# Altium project SG2002_QFN88_38_20230301_4L_V1.3_16.2.PrjPcb (part 1 of 2)
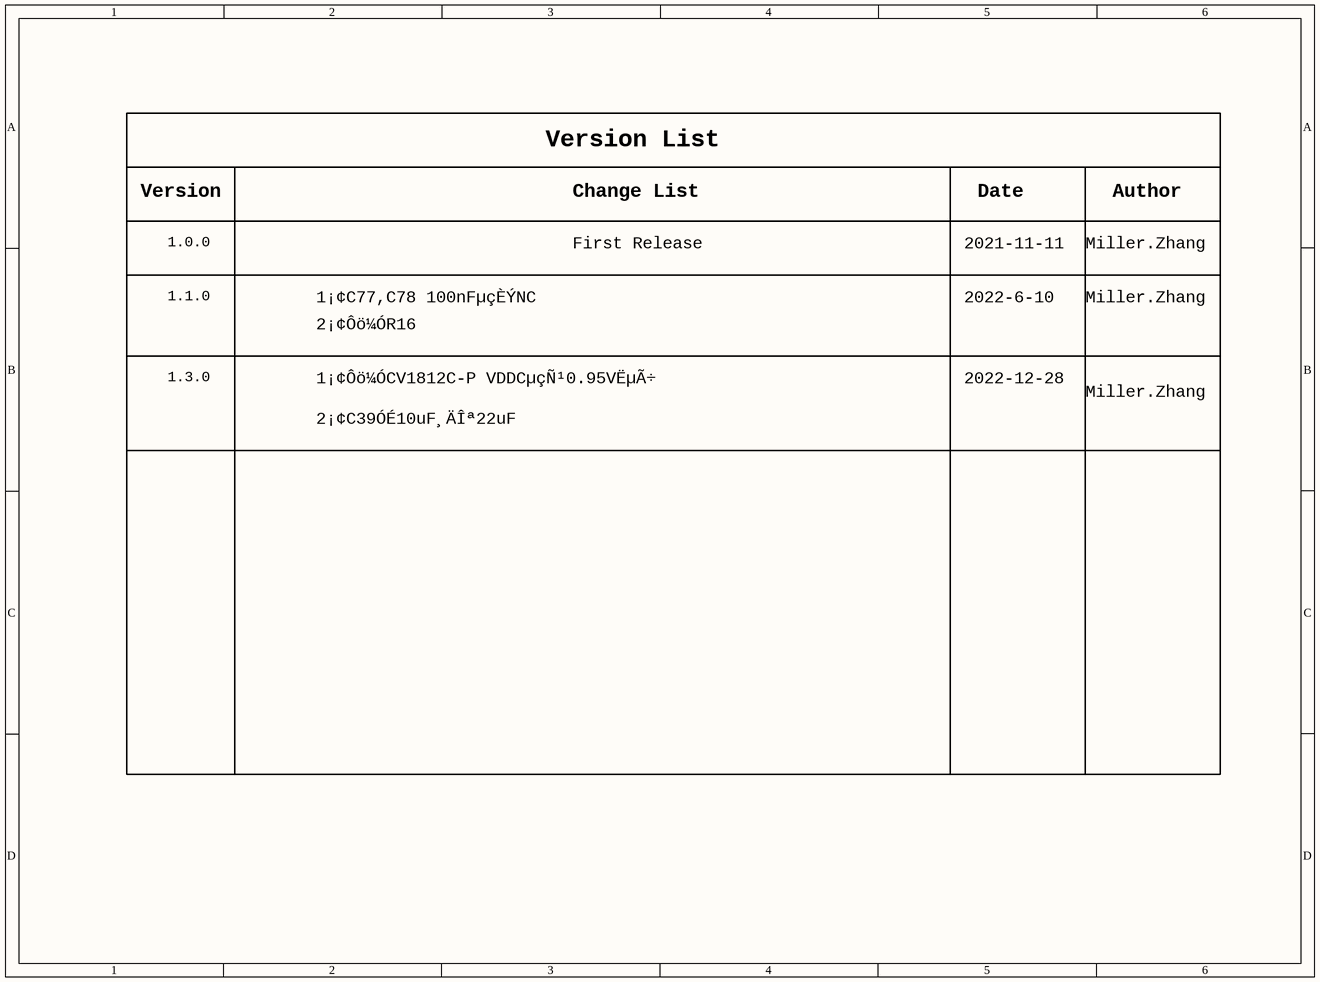
[diagram p0: 01_Cover.SchDoc]
10 sheets, 186 parts. Net scope: global (net labels, ports and power ports of the same name join across sheets).
Sheets:
  01_Cover.SchDoc
  02_Diagram.SchDoc
  03_Power tree.SchDoc
  04_Main.SchDoc
  05_SYS_Power.SchDoc
  06_eMMC_SDIO_SPINAND_SPINOR.SchDoc
  07_USB_LED.SchDoc
  08_RJ45.SchDoc
  09_AUDIO.SchDoc
  10_Sensor.SchDoc

## Sheet 01_Cover.SchDoc
size 246 x 182 mm; DsnPath: C:\Users\nilot\Documents\VSCode\SBC\imports\SG2002_QFN88_38_20230301_4L_V1.3_16.2.DSN; SchematicName: CV181xC_QFN88_38_DemoBoard; PageName: 01_Cover; PageSize: A; TopSchematic: True

### Notes on the sheet
- Version List
- Version
- 1.0.0
- First Release
- Change List
- 2021-11-11
- Date
- Miller.Zhang
- Author
- 1.1.0
- 1¡¢C77,C78 100nFµçÈÝNC
- 2¡¢Ôö¼ÓR16
- 2022-6-10
- 1.3.0
- 1¡¢Ôö¼ÓCV1812C-P VDDCµçÑ¹0.95VËµÃ÷
- 2022-12-28
- 2¡¢C39ÓÉ10uF¸ÄÎª22uF

## Sheet 02_Diagram.SchDoc
size 513 x 386 mm; DsnPath: C:\Users\nilot\Documents\VSCode\SBC\imports\SG2002_QFN88_38_20230301_4L_V1.3_16.2.DSN; SchematicName: CV181xC_QFN88_38_DemoBoard; PageName: 02_Diagram; PageSize: C; TopSchematic: True
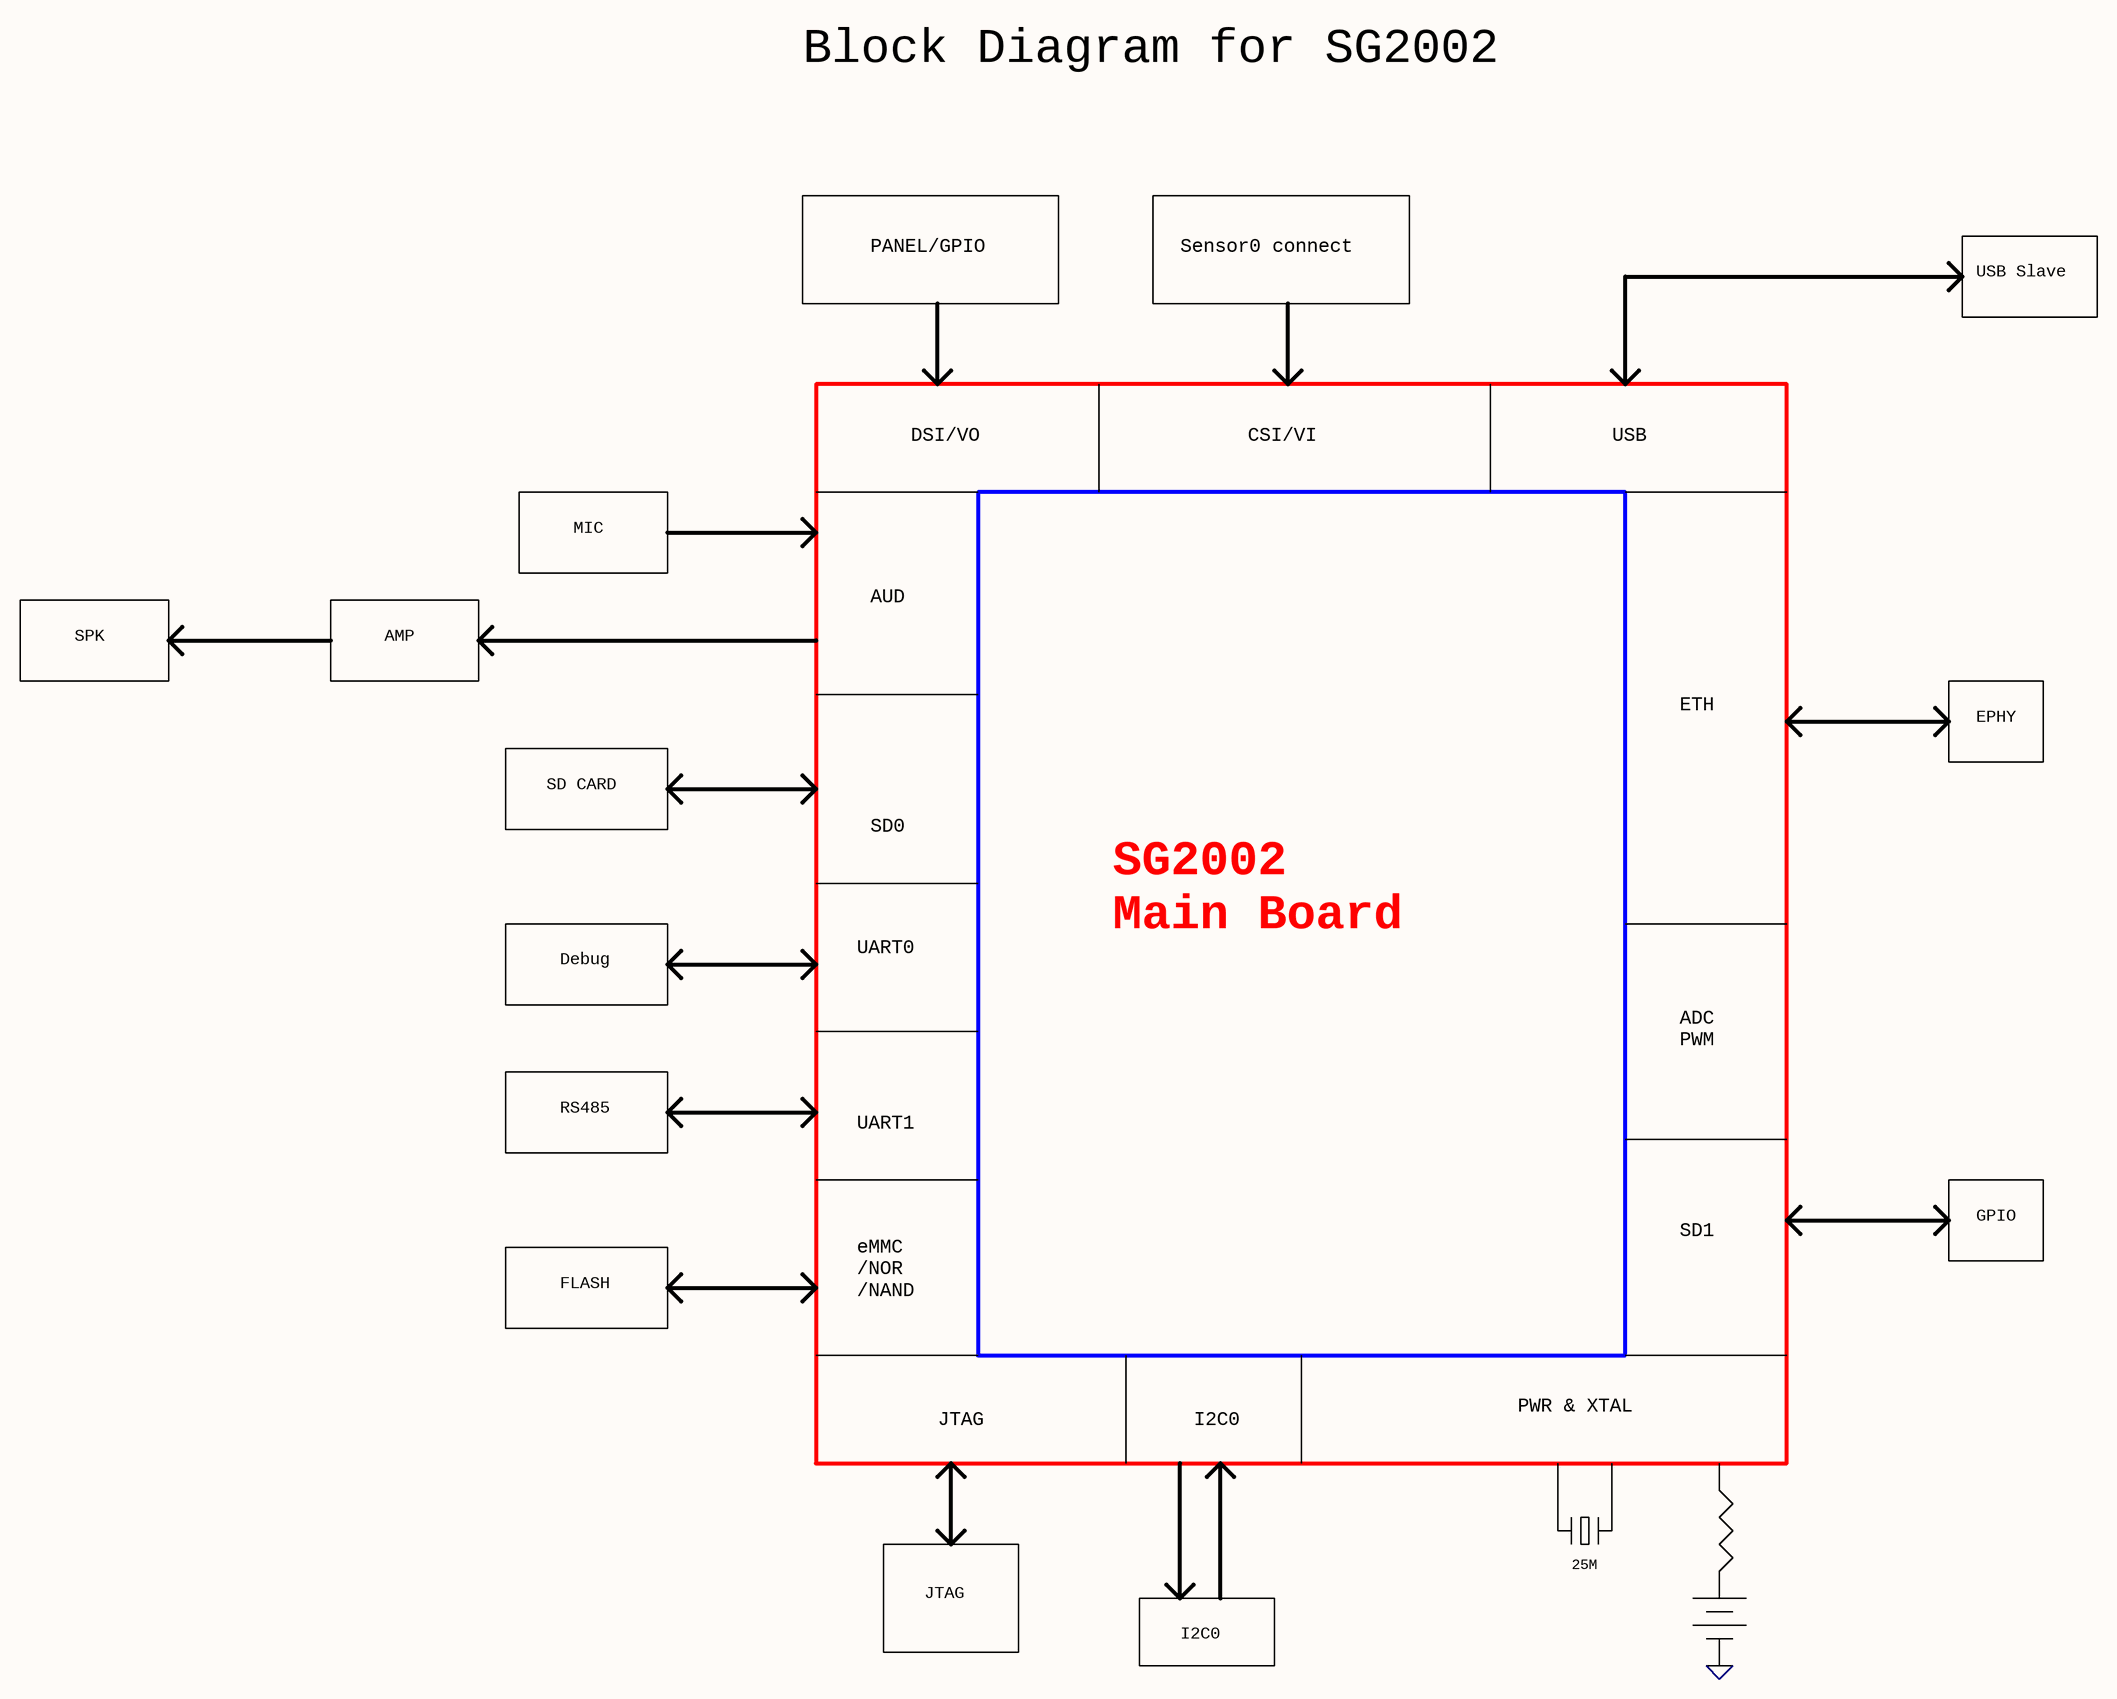
[diagram p1: 02_Diagram.SchDoc]

### Notes on the sheet
- Block Diagram for SG2002
- PANEL/GPIO
- Sensor0 connect
- USB Slave
- DSI/VO
- CSI/VI
- USB
- MIC
- AUD
- SPK
- AMP
- ETH
- EPHY
- SD CARD
- SG2002
  Main Board
- SD0
- Debug
- UART0
- ADC
  PWM
- RS485
- UART1
- eMMC
  /NOR
  /NAND
- GPIO
- FLASH
- SD1
- JTAG
- I2C0
- PWR & XTAL
- 25M

## Sheet 03_Power tree.SchDoc
size 563 x 386 mm; DsnPath: C:\Users\nilot\Documents\VSCode\SBC\imports\SG2002_QFN88_38_20230301_4L_V1.3_16.2.DSN; SchematicName: CV181xC_QFN88_38_DemoBoard; PageName: 03_Power tree; PageSize: Custom; TopSchematic: True
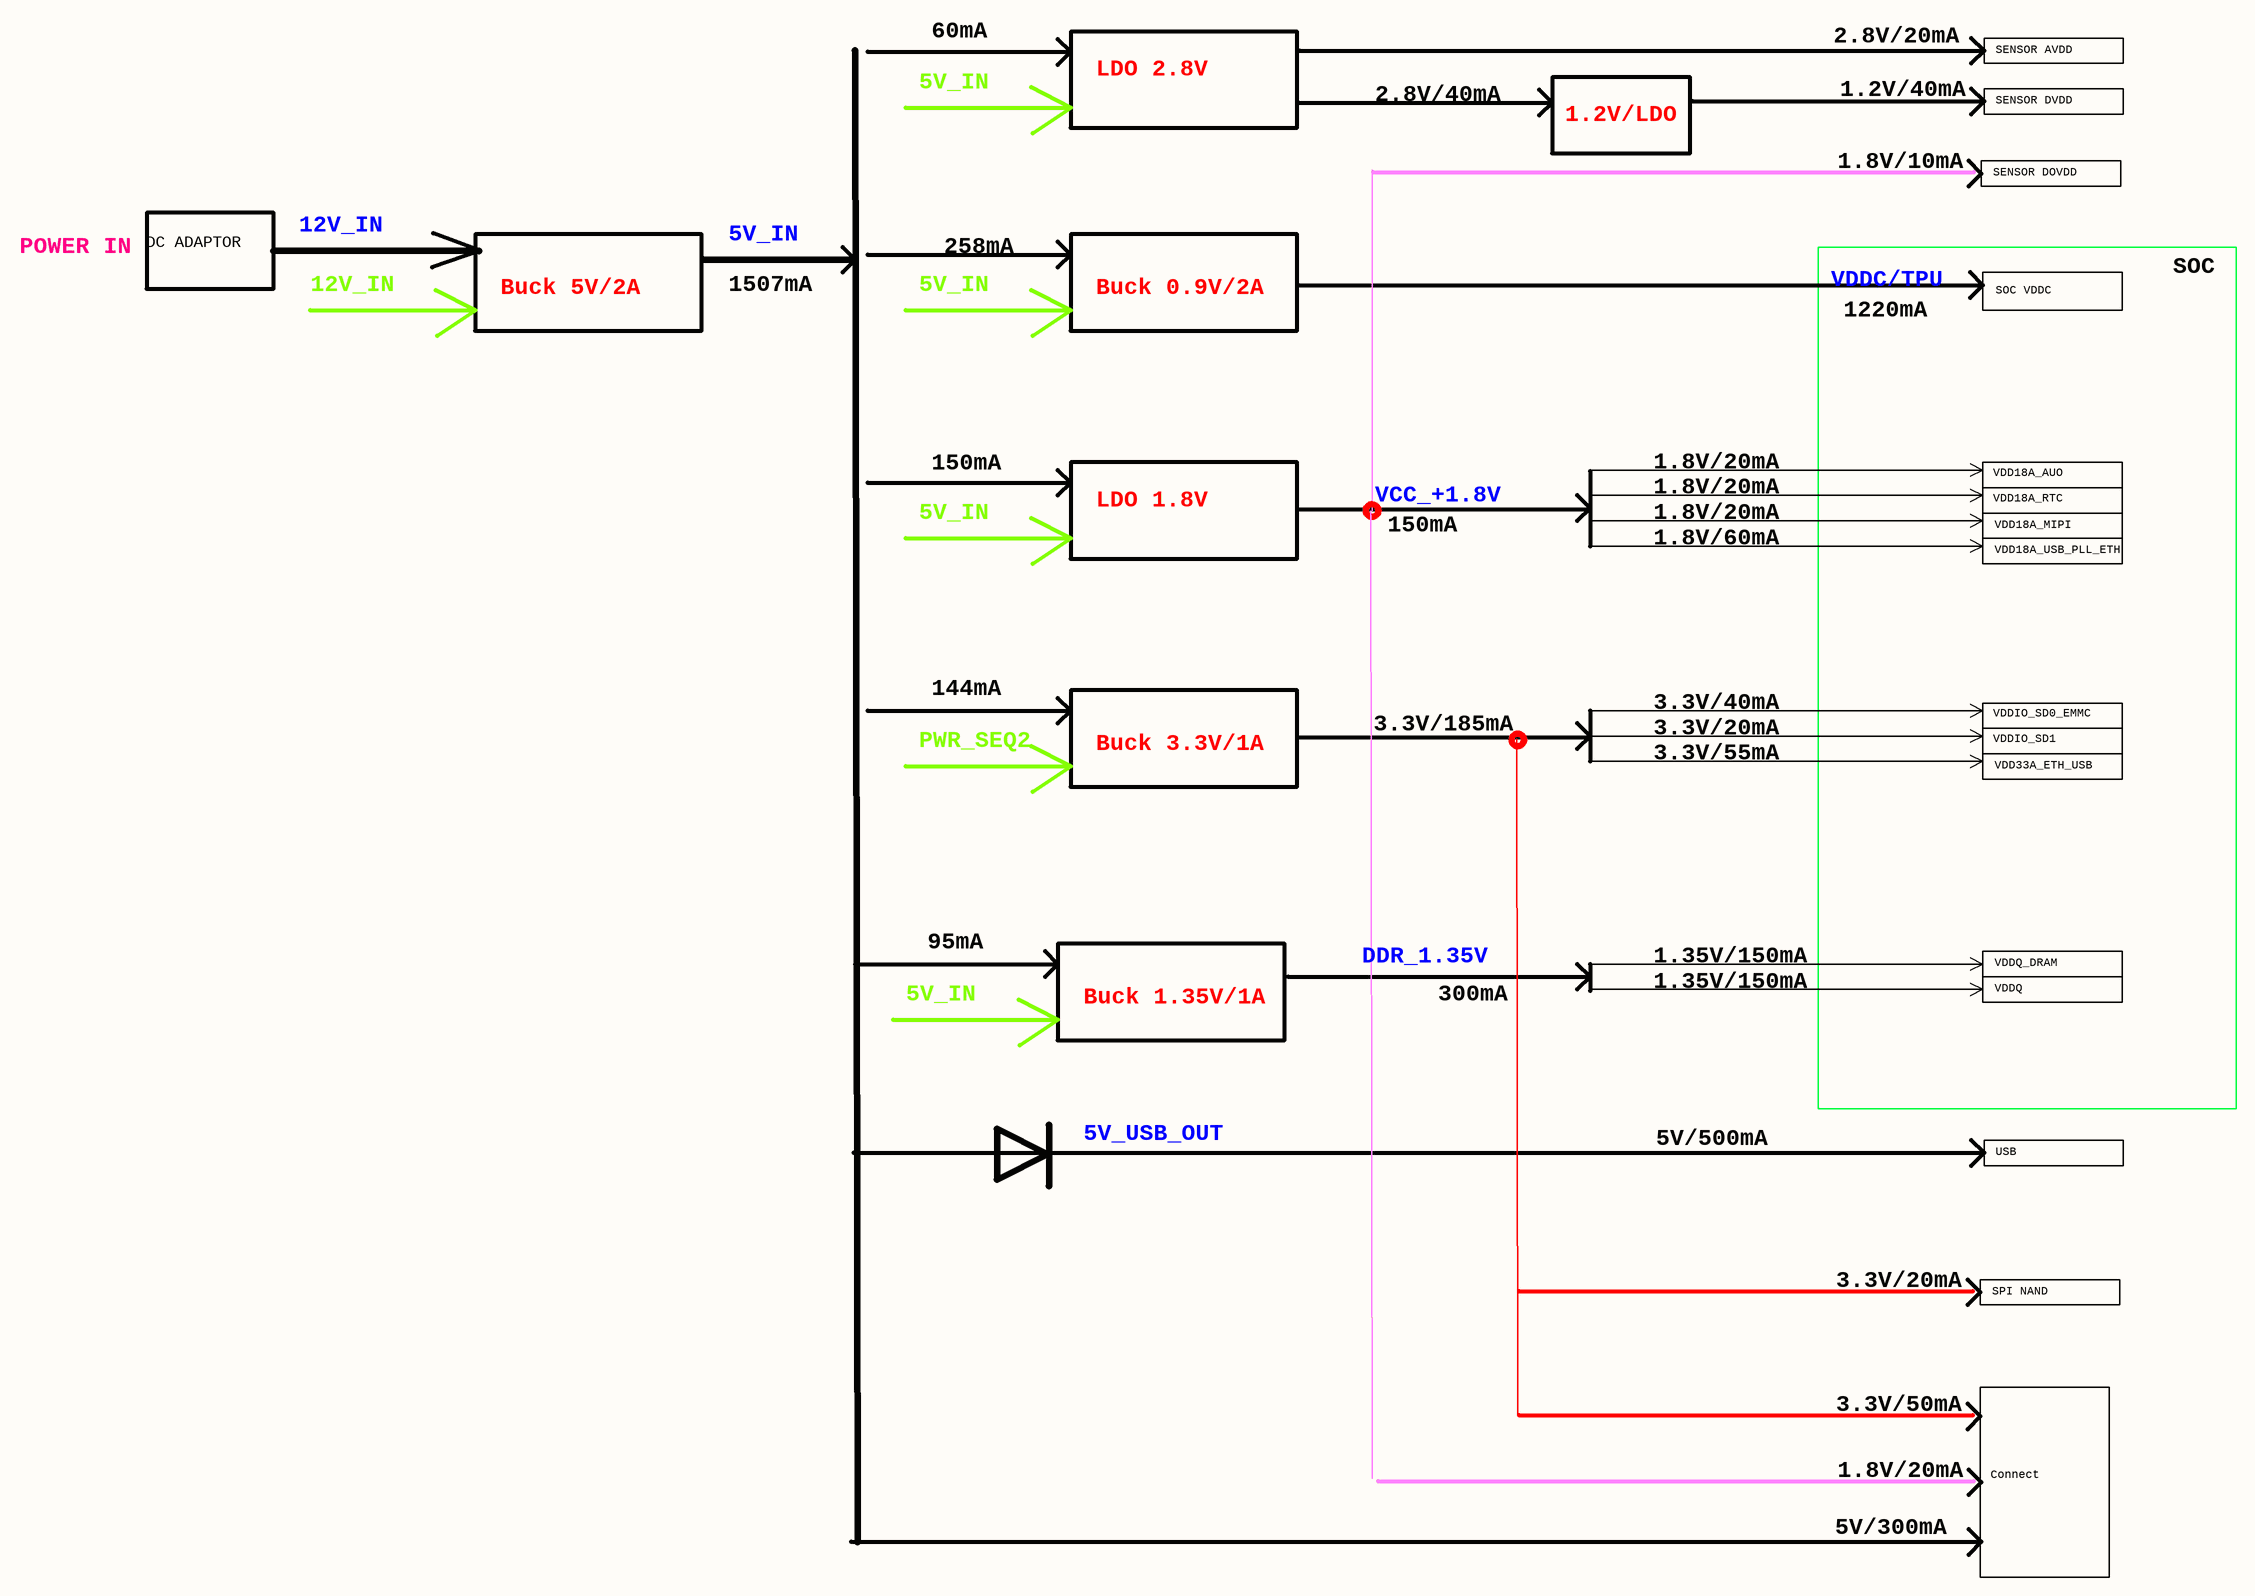
[diagram p2: 03_Power tree.SchDoc]

### Notes on the sheet
- 60mA
- 2.8V/20mA
- SENSOR AVDD
- 5V_IN
- LDO 2.8V
- 2.8V/40mA
- 1.2V/LDO
- 1.2V/40mA
- SENSOR DVDD
- 1.8V/10mA
- SENSOR DOVDD
- POWER IN
- DC ADAPTOR
- 12V_IN
- Buck 5V/2A
- 258mA
- Buck 0.9V/2A
- 1507mA
- VDDC/TPU
- 1220mA
- SOC VDDC
- SOC
- 150mA
- LDO 1.8V
- VCC_+1.8V
- 1.8V/20mA
- VDD18A_RTC
- VDD18A_AUO
- 1.8V/60mA
- VDD18A_MIPI
- VDD18A_USB_PLL_ETH
- 144mA
- Buck 3.3V/1A
- PWR_SEQ2
- 3.3V/185mA
- 3.3V/20mA
- 3.3V/40mA
- 3.3V/55mA
- VDDIO_SD1
- VDDIO_SD0_EMMC
- VDD33A_ETH_USB
- 95mA
- Buck 1.35V/1A
- DDR_1.35V
- 300mA
- 1.35V/150mA
- VDDQ
- VDDQ_DRAM
- 5V_USB_OUT
- 5V/500mA
- USB
- SPI NAND
- 3.3V/50mA
- Connect
- 5V/300mA

## Sheet 04_Main.SchDoc
size 779 x 360 mm; DsnPath: C:\Users\nilot\Documents\VSCode\SBC\imports\SG2002_QFN88_38_20230301_4L_V1.3_16.2.DSN; SchematicName: CV181xC_QFN88_38_DemoBoard; PageName: 04_Main; PageSize: Custom; TopSchematic: True
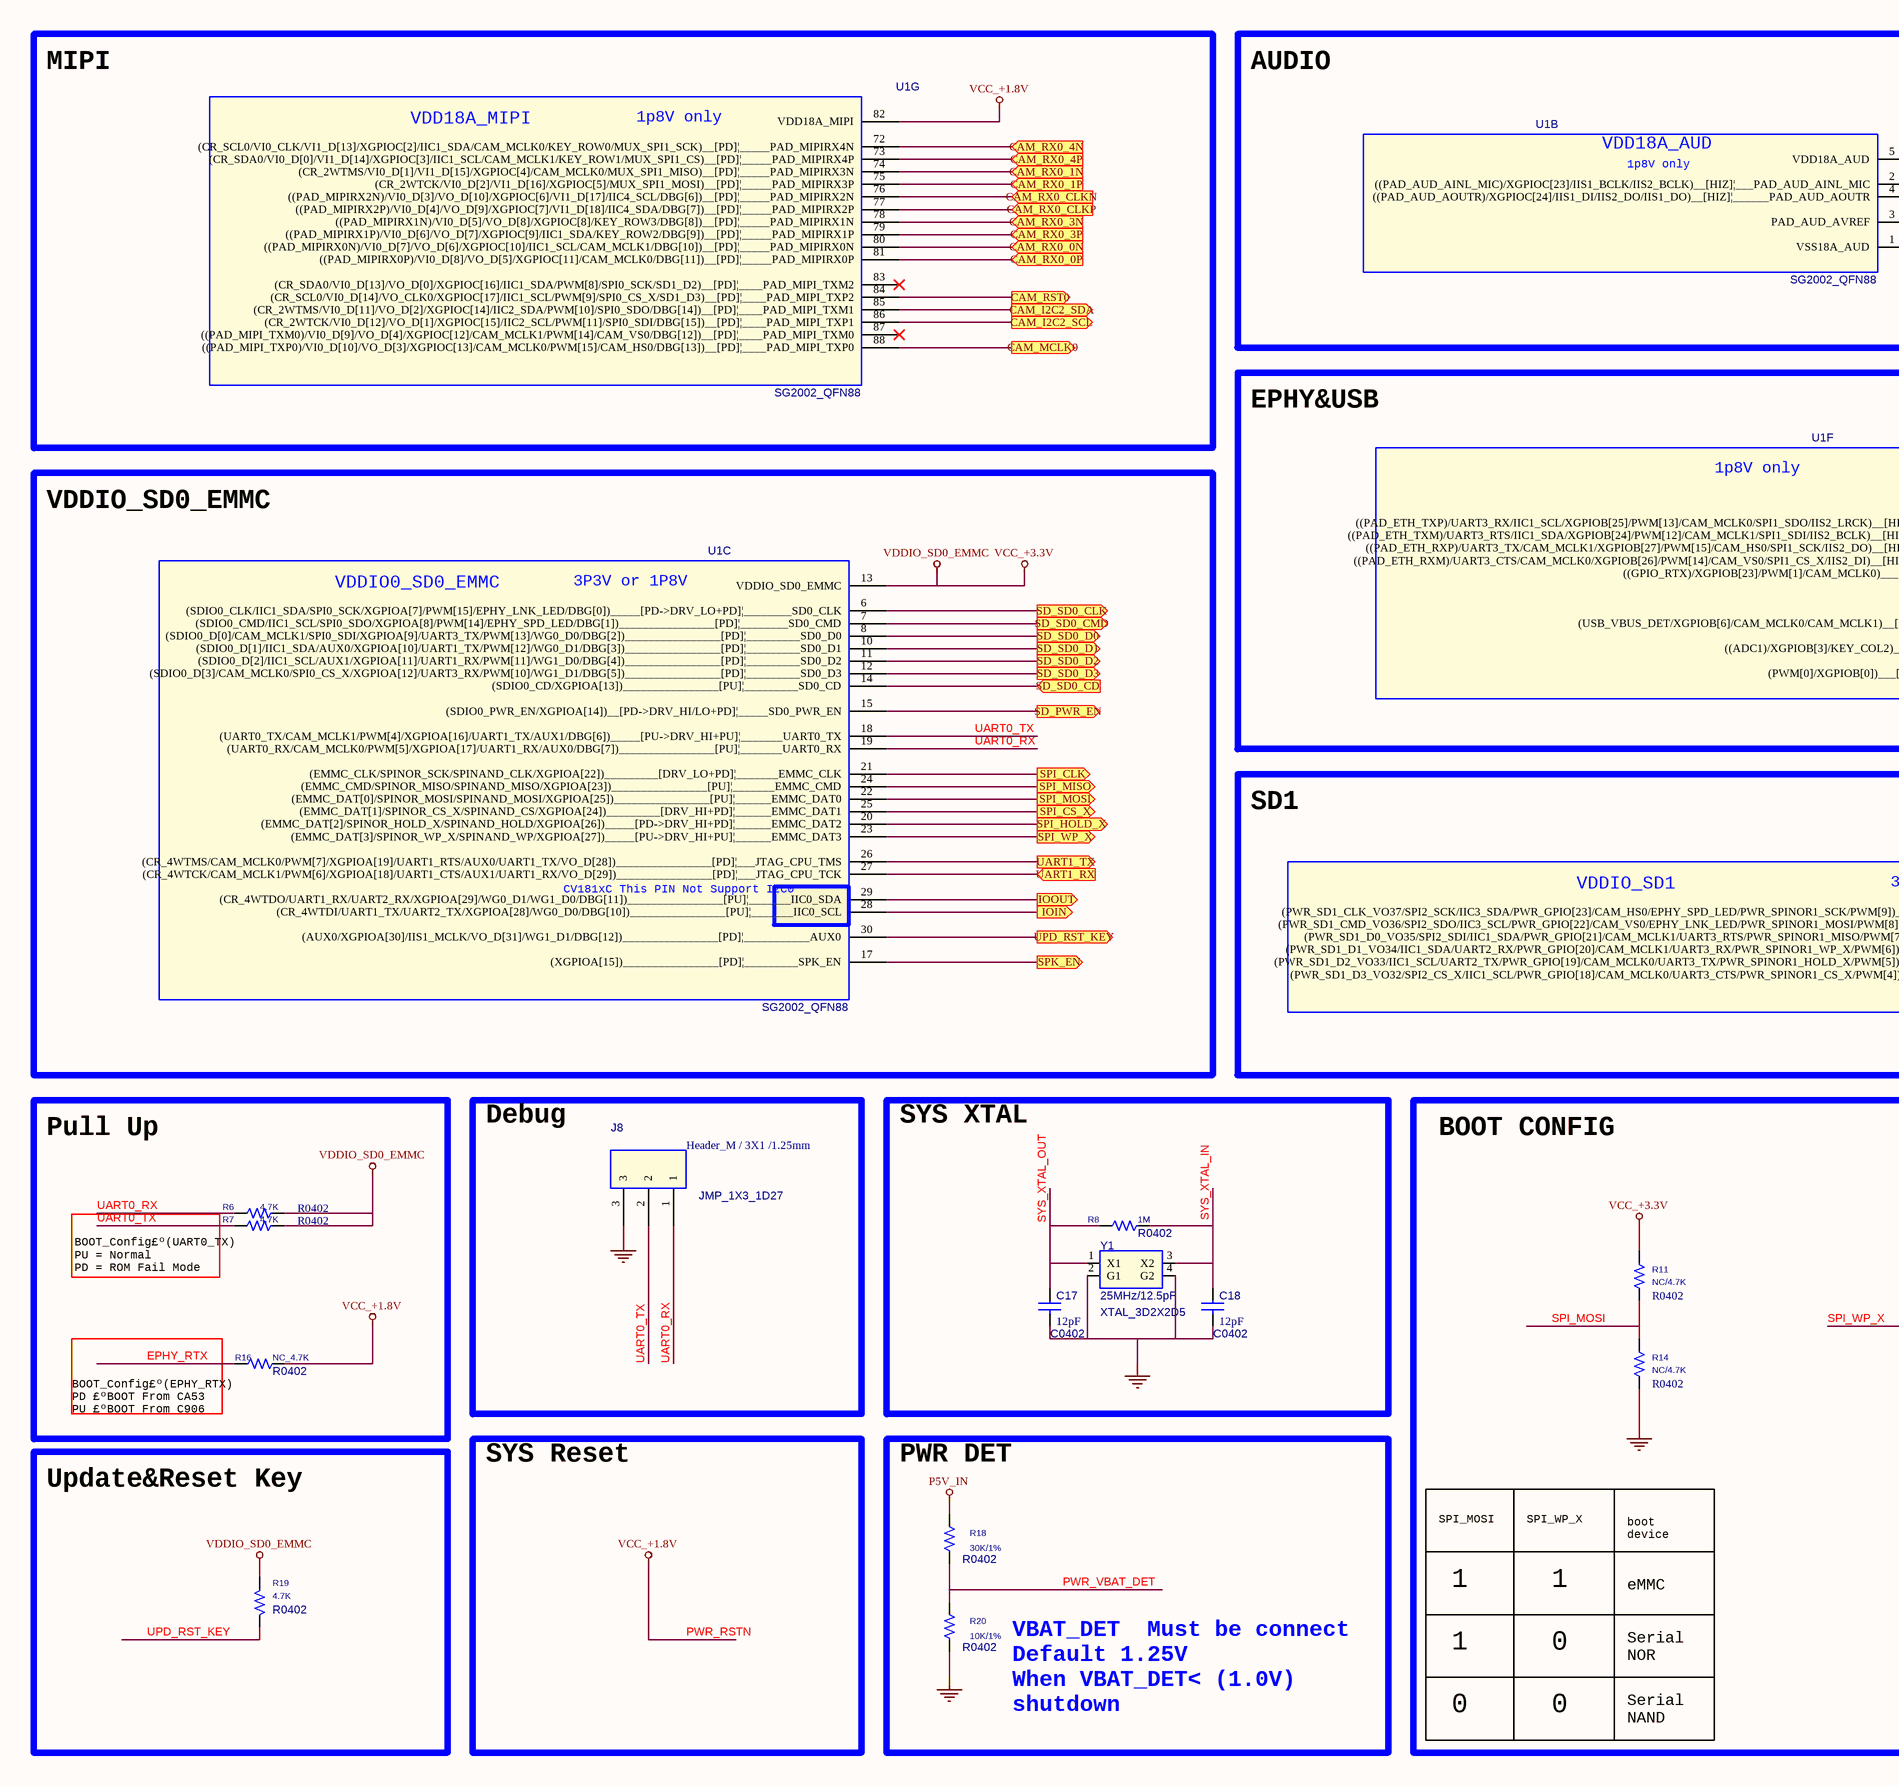
[diagram p3: 04_Main.SchDoc, left]
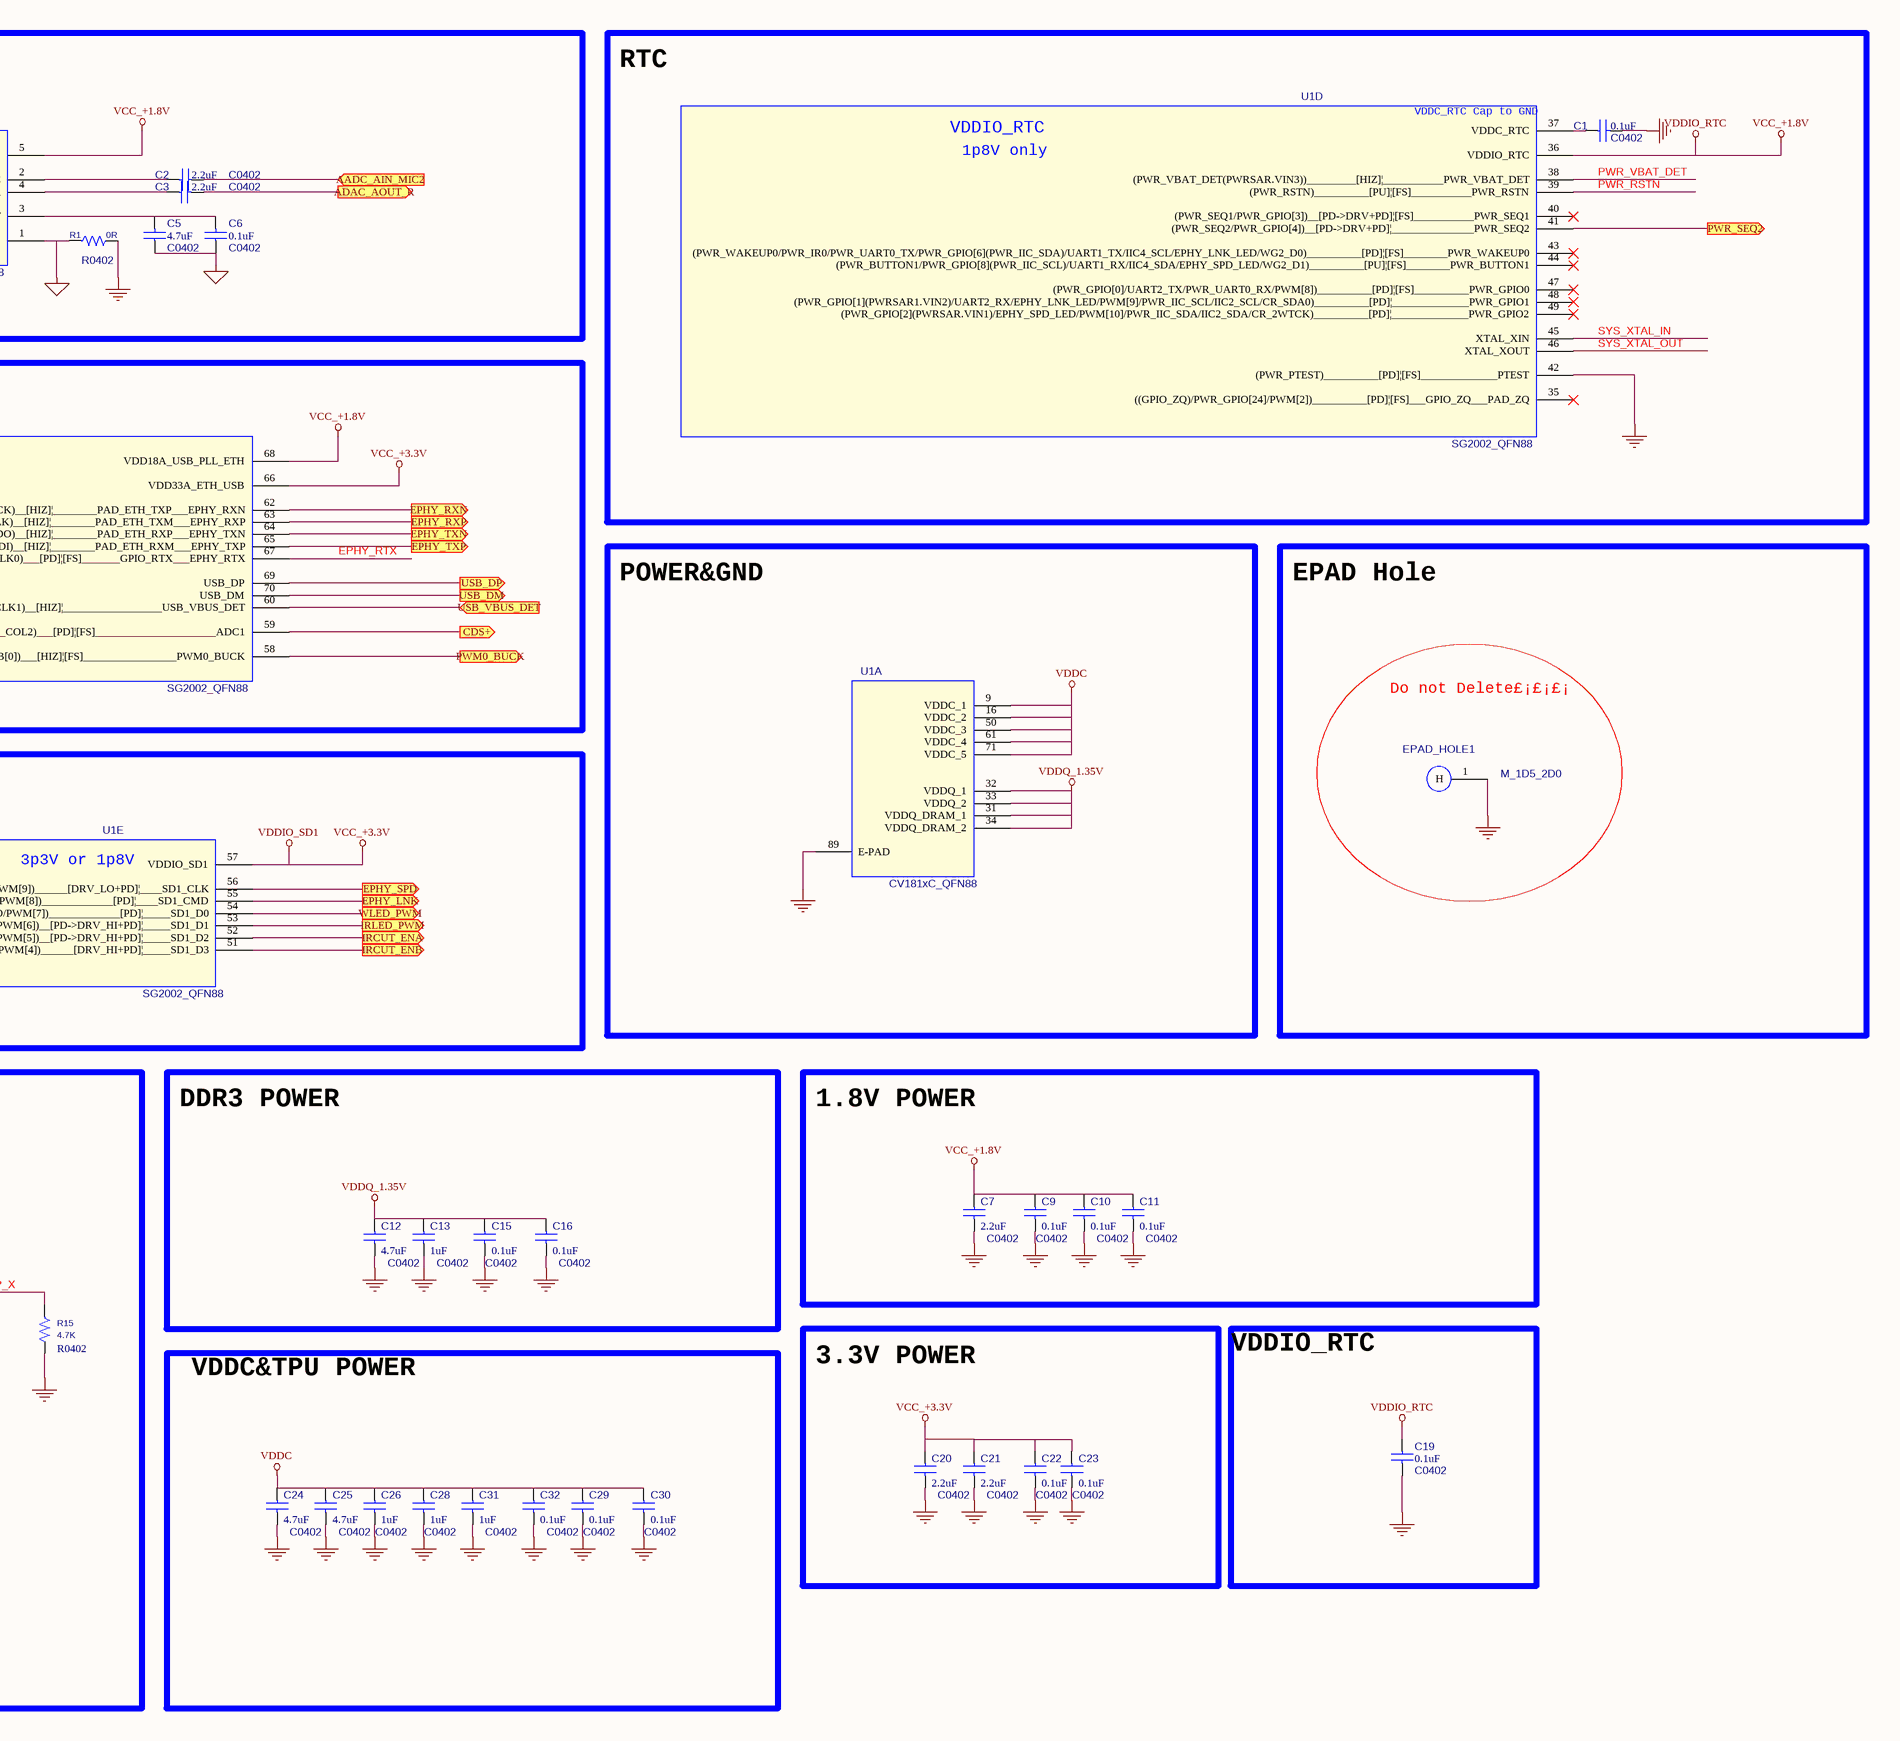
[diagram p4: 04_Main.SchDoc, right]

### Parts
C1  0.1uF  [C0402]
C2  2.2uF  [C0402]
C3  2.2uF  [C0402]
C5  4.7uF  [C0402]
C6  0.1uF  [C0402]
C7  2.2uF  [C0402]
C9  0.1uF  [C0402]
C10  0.1uF  [C0402]
C11  0.1uF  [C0402]
C12  4.7uF  [C0402]
C13  1uF  [C0402]
C15  0.1uF  [C0402]
C16  0.1uF  [C0402]
C17  12pF  [C0402]
C18  12pF  [C0402]
C19  0.1uF  [C0402]
C20  2.2uF  [C0402]
C21  2.2uF  [C0402]
C22  0.1uF  [C0402]
C23  0.1uF  [C0402]
C24  4.7uF  [C0402]
C25  4.7uF  [C0402]
C26  1uF  [C0402]
C28  1uF  [C0402]
C29  0.1uF  [C0402]
C30  0.1uF  [C0402]
C31  1uF  [C0402]
C32  0.1uF  [C0402]
EPAD_HOLE1  PCB Footprint: M_1D5_2D0  [M3_5.5X7.0_3.5]  (hidden comment: H1)
J8  Header_M / 3X1 /1.25mm  [JMP_1X3_1D27]
R1  0R  [R0402]
R6  4.7K  [R0402]
R7  4.7K  [R0402]
R8  1M  [R0402]
R11  NC/4.7K  [R0402]
R14  NC/4.7K  [R0402]
R15  4.7K  [R0402]
R16  NC_4.7K  [R0402]
R18  30K/1%  [R0402]
R19  4.7K  [R0402]
R20  10K/1%  [R0402]
U1  CV181xC_QFN88  [QFN88_9D0X9D0_0D35_E]  (parts A,B,C,D,E,F,G of 7)
Y1  25MHz/12.5pF  PCB Footprint: XTAL_3D2X2D5  [SCRY4-3_2X2_5X0_9]

### Blocks framed on the sheet
MIPI: U1
AUDIO: C2 C3 C5 C6 R1 U1
RTC: C1 U1
EPHY&USB: U1
VDDIO_SD0_EMMC: U1
POWER&GND: U1
EPAD Hole: EPAD_HOLE1
SD1: U1
Pull Up: R6 R7 R16
Debug: J8
SYS XTAL: C17 C18 R8 Y1
DDR3 POWER: C12 C13 C15 C16
1.8V POWER: C7 C9-C11
VDDC&TPU POWER: C24-C26 C28-C32
3.3V POWER: C20-C23
VDDIO_RTC: C19
Update&Reset Key: R19
PWR DET: R18 R20

### Ports
AADC_AIN_MIC2 (in), ADAC_AOUT_R (out), CAM_I2C2_SCL (out), CAM_I2C2_SDA (out), CAM_MCLK0 (out), CAM_RST0 (out), CAM_RX0_0N (in), CAM_RX0_0P (in), CAM_RX0_1N (in), CAM_RX0_1P (in), CAM_RX0_3N (in), CAM_RX0_3P (in), CAM_RX0_4N (in), CAM_RX0_4P (in), CAM_RX0_CLKN (in), CAM_RX0_CLKP (in), CDS+ (out), EPHY_LNK (out), EPHY_RXN (out), EPHY_RXP (out), EPHY_SPD (out), EPHY_TXN (out), EPHY_TXP (out), IOIN (out), IOOUT (out), IRCUT_ENA (out), IRCUT_ENB (out), IRLED_PWM (out), PWM0_BUCK (out), PWR_SEQ2 (out), SD_PWR_EN (out), SD_SD0_CD (in), SD_SD0_CLK (out), SD_SD0_CMD (out), SD_SD0_D0 (out), SD_SD0_D1 (out), SD_SD0_D2 (out), SD_SD0_D3 (out), SPI_CLK (out), SPI_CS_X (out), SPI_HOLD_X (out), SPI_MISO (out), SPI_MOSI (out), SPI_WP_X (out), SPK_EN (out), UART1_RX (in), UART1_TX (out), UPD_RST_KEY (out), USB_DM (out), USB_DP (out), USB_VBUS_DET (in), WLED_PWM (out)

### Nets
GND: C1.2 C7.2 C9.2 C10.2 C11.2 C12.2 C13.2 C15.2 C16.2 C17.2 C18.2 C19.2 C20.2 C21.2 C22.2 C23.2 C24.2 C25.2 C26.2 C28.2 C29.2 C30.2 C31.2 C32.2 EPAD_HOLE1.1(H) J8.3 R1.2 R14.2 R15.2 R20.1 U1.42((PWR_PTEST)__________[PD]|[FS]______________PTEST) U1.89(E-PAD) Y1.2(G1) Y1.4(G2)  [project net MIC1_GND]
GND_SIGNAL: C5.1 C6.1 R1.1 U1.1(VSS18A_AUD)
P5V_IN: R18.2
PWR_RSTN: C7.1 C9.1 C10.1 C11.1 C19.1 R16.2 U1.5(VDD18A_AUD) U1.36(VDDIO_RTC) U1.39((PWR_RSTN)__________[PU]|[FS]___________PWR_RSTN) U1.68(VDD18A_USB_PLL_ETH) U1.82(VDD18A_MIPI)  [also labelled VCC_+1.8V, VDDIO_RTC]
VCC_+3.3V: C20.1 C21.1 C22.1 C23.1 R6.1 R7.1 R11.1 R19.1 U1.13(VDDIO_SD0_EMMC) U1.57(VDDIO_SD1) U1.66(VDD33A_ETH_USB)  [also labelled VDDIO_SD0_EMMC, VDDIO_SD1]  [project net SPI_VCC]
VDDC: C24.1 C25.1 C26.1 C28.1 C29.1 C30.1 C31.1 C32.1 U1.9(VDDC_1) U1.16(VDDC_2) U1.50(VDDC_3) U1.61(VDDC_4) U1.71(VDDC_5)
VDDQ_1.35V: C12.1 C13.1 C15.1 C16.1 U1.31(VDDQ_DRAM_1) U1.32(VDDQ_1) U1.33(VDDQ_2) U1.34(VDDQ_DRAM_2)
EPHY_RTX: R16.1 U1.67(((GPIO_RTX)/XGPIOB[23]/PWM[1]/CAM_MCLK0)___[PD]|[FS]_______GPIO_RTX___EPHY_RTX)
PWR_VBAT_DET: R18.1 R20.2 U1.38((PWR_VBAT_DET(PWRSAR.VIN3))_________[HIZ]|___________PWR_VBAT_DET)
SPI_MOSI: R11.2 R14.1
SPI_WP_X: R15.1
SYS_XTAL_IN: C18.1 R8.1 U1.45(XTAL_XIN) Y1.3(X2)
SYS_XTAL_OUT: C17.1 R8.2 U1.46(XTAL_XOUT) Y1.1(X1)
UART0_RX: J8.1 R6.2 U1.19((UART0_RX/CAM_MCLK0/PWM[5]/XGPIOA[17]/UART1_RX/AUX0/DBG[7])________________[PU]|_______UART0_RX)
UART0_TX: J8.2 R7.2 U1.18((UART0_TX/CAM_MCLK1/PWM[4]/XGPIOA[16]/UART1_TX/AUX1/DBG[6])_____[PU->DRV_HI+PU]|_______UART0_TX)
UPD_RST_KEY: R19.2
NetC1_1: C1.1 U1.37(VDDC_RTC)
NetC2_1: C2.1 ; port AADC_AIN_MIC2
NetC2_2: C2.2 U1.2(((PAD_AUD_AINL_MIC)/XGPIOC[23]/IIS1_BCLK/IIS2_BCLK)__[HIZ]|___PAD_AUD_AINL_MIC)
NetC3_1: C3.1 U1.4(((PAD_AUD_AOUTR)/XGPIOC[24]/IIS1_DI/IIS2_DO/IIS1_DO)__[HIZ]|______PAD_AUD_AOUTR)
NetC3_2: C3.2 ; port ADAC_AOUT_R
NetC5_2: C5.2 C6.2 U1.3(PAD_AUD_AVREF)
NetU1_6: U1.6((SDIO0_CLK/IIC1_SDA/SPI0_SCK/XGPIOA[7]/PWM[15]/EPHY_LNK_LED/DBG[0])_____[PD->DRV_LO+PD]|________SD0_CLK) ; port SD_SD0_CLK
NetU1_7: U1.7((SDIO0_CMD/IIC1_SCL/SPI0_SDO/XGPIOA[8]/PWM[14]/EPHY_SPD_LED/DBG[1])________________[PD]|________SD0_CMD) ; port SD_SD0_CMD
NetU1_8: U1.8((SDIO0_D[0]/CAM_MCLK1/SPI0_SDI/XGPIOA[9]/UART3_TX/PWM[13]/WG0_D0/DBG[2])________________[PD]|_________SD0_D0) ; port SD_SD0_D0
NetU1_10: U1.10((SDIO0_D[1]/IIC1_SDA/AUX0/XGPIOA[10]/UART1_TX/PWM[12]/WG0_D1/DBG[3])________________[PD]|_________SD0_D1) ; port SD_SD0_D1
NetU1_11: U1.11((SDIO0_D[2]/IIC1_SCL/AUX1/XGPIOA[11]/UART1_RX/PWM[11]/WG1_D0/DBG[4])________________[PD]|_________SD0_D2) ; port SD_SD0_D2
NetU1_12: U1.12((SDIO0_D[3]/CAM_MCLK0/SPI0_CS_X/XGPIOA[12]/UART3_RX/PWM[10]/WG1_D1/DBG[5])________________[PD]|_________SD0_D3) ; port SD_SD0_D3
NetU1_14: U1.14((SDIO0_CD/XGPIOA[13])________________[PU]|_________SD0_CD) ; port SD_SD0_CD
NetU1_15: U1.15((SDIO0_PWR_EN/XGPIOA[14])__[PD->DRV_HI/LO+PD]|_____SD0_PWR_EN) ; port SD_PWR_EN
NetU1_17: U1.17((XGPIOA[15])________________[PD]|_________SPK_EN) ; port SPK_EN
NetU1_20: U1.20((EMMC_DAT[2]/SPINOR_HOLD_X/SPINAND_HOLD/XGPIOA[26])_____[PD->DRV_HI+PD]|______EMMC_DAT2) ; port SPI_HOLD_X
NetU1_21: U1.21((EMMC_CLK/SPINOR_SCK/SPINAND_CLK/XGPIOA[22])_________[DRV_LO+PD]|_______EMMC_CLK) ; port SPI_CLK
NetU1_22: U1.22((EMMC_DAT[0]/SPINOR_MOSI/SPINAND_MOSI/XGPIOA[25])________________[PU]|______EMMC_DAT0) ; port SPI_MOSI
NetU1_23: U1.23((EMMC_DAT[3]/SPINOR_WP_X/SPINAND_WP/XGPIOA[27])_____[PU->DRV_HI+PU]|______EMMC_DAT3) ; port SPI_WP_X
NetU1_24: U1.24((EMMC_CMD/SPINOR_MISO/SPINAND_MISO/XGPIOA[23])________________[PU]|_______EMMC_CMD) ; port SPI_MISO
NetU1_25: U1.25((EMMC_DAT[1]/SPINOR_CS_X/SPINAND_CS/XGPIOA[24])_________[DRV_HI+PD]|______EMMC_DAT1) ; port SPI_CS_X
NetU1_26: U1.26((CR_4WTMS/CAM_MCLK0/PWM[7]/XGPIOA[19]/UART1_RTS/AUX0/UART1_TX/VO_D[28])________________[PD]|___JTAG_CPU_TMS) ; port UART1_TX
NetU1_27: U1.27((CR_4WTCK/CAM_MCLK1/PWM[6]/XGPIOA[18]/UART1_CTS/AUX1/UART1_RX/VO_D[29])________________[PD]|___JTAG_CPU_TCK) ; port UART1_RX
NetU1_28: U1.28((CR_4WTDI/UART1_TX/UART2_TX/XGPIOA[28]/WG0_D0/DBG[10])________________[PU]|_______IIC0_SCL) ; port IOIN
NetU1_29: U1.29((CR_4WTDO/UART1_RX/UART2_RX/XGPIOA[29]/WG0_D1/WG1_D0/DBG[11])________________[PU]|_______IIC0_SDA) ; port IOOUT
NetU1_30: U1.30((AUX0/XGPIOA[30]/IIS1_MCLK/VO_D[31]/WG1_D1/DBG[12])________________[PD]|___________AUX0) ; port UPD_RST_KEY
NetU1_41: U1.41((PWR_SEQ2/PWR_GPIO[4])__[PD->DRV+PD]|_______________PWR_SEQ2) ; port PWR_SEQ2
NetU1_51: U1.51((PWR_SD1_D3_VO32/SPI2_CS_X/IIC1_SCL/PWR_GPIO[18]/CAM_MCLK0/UART3_CTS/PWR_SPINOR1_CS_X/PWM[4])______[DRV_HI+PD]|_____SD1_D3) ; port IRCUT_ENB
NetU1_52: U1.52((PWR_SD1_D2_VO33/IIC1_SCL/UART2_TX/PWR_GPIO[19]/CAM_MCLK0/UART3_TX/PWR_SPINOR1_HOLD_X/PWM[5])__[PD->DRV_HI+PD]|_____SD1_D2) ; port IRCUT_ENA
NetU1_53: U1.53((PWR_SD1_D1_VO34/IIC1_SDA/UART2_RX/PWR_GPIO[20]/CAM_MCLK1/UART3_RX/PWR_SPINOR1_WP_X/PWM[6])__[PD->DRV_HI+PD]|_____SD1_D1) ; port IRLED_PWM
NetU1_54: U1.54((PWR_SD1_D0_VO35/SPI2_SDI/IIC1_SDA/PWR_GPIO[21]/CAM_MCLK1/UART3_RTS/PWR_SPINOR1_MISO/PWM[7])_____________[PD]|_____SD1_D0) ; port WLED_PWM
NetU1_55: U1.55((PWR_SD1_CMD_VO36/SPI2_SDO/IIC3_SCL/PWR_GPIO[22]/CAM_VS0/EPHY_LNK_LED/PWR_SPINOR1_MOSI/PWM[8])_____________[PD]|____SD1_CMD) ; port EPHY_LNK
NetU1_56: U1.56((PWR_SD1_CLK_VO37/SPI2_SCK/IIC3_SDA/PWR_GPIO[23]/CAM_HS0/EPHY_SPD_LED/PWR_SPINOR1_SCK/PWM[9])______[DRV_LO+PD]|____SD1_CLK) ; port EPHY_SPD
NetU1_58: U1.58((PWM[0]/XGPIOB[0])___[HIZ]|[FS]_________________PWM0_BUCK) ; port PWM0_BUCK
NetU1_59: U1.59(((ADC1)/XGPIOB[3]/KEY_COL2)___[PD]|[FS]______________________ADC1) ; port CDS+
NetU1_60: U1.60((USB_VBUS_DET/XGPIOB[6]/CAM_MCLK0/CAM_MCLK1)__[HIZ]|__________________USB_VBUS_DET) ; port USB_VBUS_DET
NetU1_62: U1.62(((PAD_ETH_TXP)/UART3_RX/IIC1_SCL/XGPIOB[25]/PWM[13]/CAM_MCLK0/SPI1_SDO/IIS2_LRCK)__[HIZ]|________PAD_ETH_TXP___EPHY_RXN) ; port EPHY_RXN
NetU1_63: U1.63(((PAD_ETH_TXM)/UART3_RTS/IIC1_SDA/XGPIOB[24]/PWM[12]/CAM_MCLK1/SPI1_SDI/IIS2_BCLK)__[HIZ]|________PAD_ETH_TXM___EPHY_RXP) ; port EPHY_RXP
NetU1_64: U1.64(((PAD_ETH_RXP)/UART3_TX/CAM_MCLK1/XGPIOB[27]/PWM[15]/CAM_HS0/SPI1_SCK/IIS2_DO)__[HIZ]|________PAD_ETH_RXP___EPHY_TXN) ; port EPHY_TXN
NetU1_65: U1.65(((PAD_ETH_RXM)/UART3_CTS/CAM_MCLK0/XGPIOB[26]/PWM[14]/CAM_VS0/SPI1_CS_X/IIS2_DI)__[HIZ]|________PAD_ETH_RXM___EPHY_TXP) ; port EPHY_TXP
NetU1_69: U1.69(USB_DP) ; port USB_DP
NetU1_70: U1.70(USB_DM) ; port USB_DM
NetU1_72: U1.72((CR_SCL0/VI0_CLK/VI1_D[13]/XGPIOC[2]/IIC1_SDA/CAM_MCLK0/KEY_ROW0/MUX_SPI1_SCK)__[PD]|_____PAD_MIPIRX4N) ; port CAM_RX0_4N
NetU1_73: U1.73((CR_SDA0/VI0_D[0]/VI1_D[14]/XGPIOC[3]/IIC1_SCL/CAM_MCLK1/KEY_ROW1/MUX_SPI1_CS)__[PD]|_____PAD_MIPIRX4P) ; port CAM_RX0_4P
NetU1_74: U1.74((CR_2WTMS/VI0_D[1]/VI1_D[15]/XGPIOC[4]/CAM_MCLK0/MUX_SPI1_MISO)__[PD]|_____PAD_MIPIRX3N) ; port CAM_RX0_1N
NetU1_75: U1.75((CR_2WTCK/VI0_D[2]/VI1_D[16]/XGPIOC[5]/MUX_SPI1_MOSI)__[PD]|_____PAD_MIPIRX3P) ; port CAM_RX0_1P
NetU1_76: U1.76(((PAD_MIPIRX2N)/VI0_D[3]/VO_D[10]/XGPIOC[6]/VI1_D[17]/IIC4_SCL/DBG[6])__[PD]|_____PAD_MIPIRX2N) ; port CAM_RX0_CLKN
NetU1_77: U1.77(((PAD_MIPIRX2P)/VI0_D[4]/VO_D[9]/XGPIOC[7]/VI1_D[18]/IIC4_SDA/DBG[7])__[PD]|_____PAD_MIPIRX2P) ; port CAM_RX0_CLKP
NetU1_78: U1.78(((PAD_MIPIRX1N)/VI0_D[5]/VO_D[8]/XGPIOC[8]/KEY_ROW3/DBG[8])__[PD]|_____PAD_MIPIRX1N) ; port CAM_RX0_3N
NetU1_79: U1.79(((PAD_MIPIRX1P)/VI0_D[6]/VO_D[7]/XGPIOC[9]/IIC1_SDA/KEY_ROW2/DBG[9])__[PD]|_____PAD_MIPIRX1P) ; port CAM_RX0_3P
NetU1_80: U1.80(((PAD_MIPIRX0N)/VI0_D[7]/VO_D[6]/XGPIOC[10]/IIC1_SCL/CAM_MCLK1/DBG[10])__[PD]|_____PAD_MIPIRX0N) ; port CAM_RX0_0N
NetU1_81: U1.81(((PAD_MIPIRX0P)/VI0_D[8]/VO_D[5]/XGPIOC[11]/CAM_MCLK0/DBG[11])__[PD]|_____PAD_MIPIRX0P) ; port CAM_RX0_0P
NetU1_84: U1.84((CR_SCL0/VI0_D[14]/VO_CLK0/XGPIOC[17]/IIC1_SCL/PWM[9]/SPI0_CS_X/SD1_D3)__[PD]|____PAD_MIPI_TXP2) ; port CAM_RST0
NetU1_85: U1.85((CR_2WTMS/VI0_D[11]/VO_D[2]/XGPIOC[14]/IIC2_SDA/PWM[10]/SPI0_SDO/DBG[14])__[PD]|____PAD_MIPI_TXM1) ; port CAM_I2C2_SDA
NetU1_86: U1.86((CR_2WTCK/VI0_D[12]/VO_D[1]/XGPIOC[15]/IIC2_SCL/PWM[11]/SPI0_SDI/DBG[15])__[PD]|____PAD_MIPI_TXP1) ; port CAM_I2C2_SCL
NetU1_88: U1.88(((PAD_MIPI_TXP0)/VI0_D[10]/VO_D[3]/XGPIOC[13]/CAM_MCLK0/PWM[15]/CAM_HS0/DBG[13])__[PD]|____PAD_MIPI_TXP0) ; port CAM_MCLK0

Not connected (* = marked no-connect by the designer): U1 35(((GPIO_ZQ)/PWR_GPIO[24]/PWM[2])__________[PD]|[FS]___GPIO_ZQ___PAD_ZQ)* 40((PWR_SEQ1/PWR_GPIO[3])__[PD->DRV+PD]|[FS]___________PWR_SEQ1)* 43((PWR_WAKEUP0/PWR_IR0/PWR_UART0_TX/PWR_GPIO[6](PWR_IIC_SDA)/UART1_TX/IIC4_SCL/EPHY_LNK_LED/WG2_D0)__________[PD]|[FS]________PWR_WAKEUP0)* 44((PWR_BUTTON1/PWR_GPIO[8](PWR_IIC_SCL)/UART1_RX/IIC4_SDA/EPHY_SPD_LED/WG2_D1)__________[PU]|[FS]________PWR_BUTTON1)* 47((PWR_GPIO[0]/UART2_TX/PWR_UART0_RX/PWM[8])__________[PD]|[FS]__________PWR_GPIO0)* 48((PWR_GPIO[1](PWRSAR1.VIN2)/UART2_RX/EPHY_LNK_LED/PWM[9]/PWR_IIC_SCL/IIC2_SCL/CR_SDA0)__________[PD]|______________PWR_GPIO1)* 49((PWR_GPIO[2](PWRSAR.VIN1)/EPHY_SPD_LED/PWM[10]/PWR_IIC_SDA/IIC2_SDA/CR_2WTCK)__________[PD]|______________PWR_GPIO2)* 83((CR_SDA0/VI0_D[13]/VO_D[0]/XGPIOC[16]/IIC1_SDA/PWM[8]/SPI0_SCK/SD1_D2)__[PD]|____PAD_MIPI_TXM2)* 87(((PAD_MIPI_TXM0)/VI0_D[9]/VO_D[4]/XGPIOC[12]/CAM_MCLK1/PWM[14]/CAM_VS0/DBG[12])__[PD]|____PAD_MIPI_TXM0)*

### Notes on the sheet
- Do not Delete£¡£¡£¡
- BOOT CONFIG
- BOOT_Config£º(UART0_TX)
  PU = Normal
  PD = ROM Fail Mode
- (near R16) BOOT_Config£º(EPHY_RTX)
  PD £ºBOOT From CA53
  PU £ºBOOT From C906
- SYS Reset
- SPI_MOSI
- SPI_WP_X
- boot device
  selection
- VBAT_DET  Must be connect
  Default 1.25V
  When VBAT_DET< (1.0V)
  shutdown
- 1
- eMMC
- Serial
  NOR
- 0
- Serial
  NAND
- (in symbol Mars_CV181XC_QFN88, part B) 1p8V only
- (in symbol Mars_CV181XC_QFN88, part C) VDDIO0_SD0_EMMC; 3P3V or 1P8V; CV181xC This PIN Not Support I2C0
- (in symbol Mars_CV181XC_QFN88, part D) VDDC_RTC Cap to GND; 1p8V only
- (in symbol Mars_CV181XC_QFN88, part E) 3p3V or 1p8V
- (in symbol Mars_CV181XC_QFN88, part F) 1p8V only
- (in symbol Mars_CV181XC_QFN88, part G) 1p8V only

### Library data of the parts
C1 = C: C0201; Part Number: GRM155R61E104KA87D; Part Reference: C1; Cloud IC Number: Y02110431K00; Vendor: murata; Part Name: C0201; Value: 0.1uF; PCB Footprint: C0402
C2 = C: C0402; Part Name: sC0402; Part Number: GRM155R61E104KA87D; Part Reference: C2; Cloud IC Number: Y02110431K00; Vendor: murata; Value: 2.2uF; PCB Footprint: C0402
C3 = C: C0402; Part Name: sC0402; Part Number: GRM155R61E104KA87D; Part Reference: C3; Cloud IC Number: Y02110431K00; Vendor: murata; Value: 2.2uF; PCB Footprint: C0402
C5 = C: C0603; Part Number: GRM155R61E104KA87D; Part Reference: C5; Cloud IC Number: Y02110431K00; Vendor: murata; Part Name: C0603; Value: 4.7uF; PCB Footprint: C0402
C6 = C: C0603; Part Number: GRM155R61E104KA87D; Part Reference: C6; Cloud IC Number: Y02110431K00; Vendor: murata; Part Name: C0603; Value: 0.1uF; PCB Footprint: C0402
C7 = C: C0402; Part Number: GRM155R61E104KA87D; Part Reference: C7; Cloud IC Number: Y02110431K00; Vendor: murata; Part Name: C0402; Value: 2.2uF; PCB Footprint: C0402
C9 = C: C0201; Part Number: GRM155R61E104KA87D; Part Reference: C9; Cloud IC Number: Y02110431K00; Vendor: murata; Part Name: C0201; Value: 0.1uF; PCB Footprint: C0402
C10 = C: C0201; Part Number: GRM155R61E104KA87D; Part Reference: C10; Cloud IC Number: Y02110431K00; Vendor: murata; Part Name: C0201; Value: 0.1uF; PCB Footprint: C0402
C11 = C: C0201; Part Number: GRM155R61E104KA87D; Part Reference: C11; Cloud IC Number: Y02110431K00; Vendor: murata; Part Name: C0201; Value: 0.1uF; PCB Footprint: C0402
C12 = C: C0402; Part Number: GRM155R61E104KA87D; Part Reference: C12; Cloud IC Number: Y02110431K00; Vendor: murata; Part Name: C0402; Value: 4.7uF; PCB Footprint: C0402
C13 = C: C0402; Part Number: GRM155R61E104KA87D; Part Reference: C13; Cloud IC Number: Y02110431K00; Vendor: murata; Part Name: C0402; Value: 1uF; PCB Footprint: C0402
C15 = C: C0201; Part Number: GRM155R61E104KA87D; Part Reference: C15; Cloud IC Number: Y02110431K00; Vendor: murata; Part Name: C0201; Value: 0.1uF; PCB Footprint: C0402
C16 = C: C0201; Part Number: GRM155R61E104KA87D; Part Reference: C16; Cloud IC Number: Y02110431K00; Vendor: murata; Part Name: C0201; Value: 0.1uF; PCB Footprint: C0402
C17 = C: C0402; Part Number: GRM155R61E104KA87D; Part Reference: C17; Cloud IC Number: Y02110431K00; Vendor: murata; Part Name: C0402; Value: 12pF; PCB Footprint: C0402
C18 = C: C0402; Part Number: GRM155R61E104KA87D; Part Reference: C18; Cloud IC Number: Y02110431K00; Vendor: murata; Part Name: C0402; Value: 12pF; PCB Footprint: C0402
C19 = C: C0201; Part Number: GRM155R61E104KA87D; Part Reference: C19; Cloud IC Number: Y02110431K00; Vendor: murata; Part Name: C0201; Value: 0.1uF; PCB Footprint: C0402
C20 = C: C0402; Part Number: GRM155R61E104KA87D; Part Reference: C20; Cloud IC Number: Y02110431K00; Vendor: murata; Part Name: C0402; Value: 2.2uF; PCB Footprint: C0402
C21 = C: C0402; Part Number: GRM155R61E104KA87D; Part Reference: C21; Cloud IC Number: Y02110431K00; Vendor: murata; Part Name: C0402; Value: 2.2uF; PCB Footprint: C0402
C22 = C: C0402; Part Number: GRM155R61E104KA87D; Part Reference: C22; Cloud IC Number: Y02110431K00; Vendor: murata; Part Name: C0402; Value: 0.1uF; PCB Footprint: C0402
C23 = C: C0201; Part Number: GRM155R61E104KA87D; Part Reference: C23; Cloud IC Number: Y02110431K00; Vendor: murata; Part Name: C0201; Value: 0.1uF; PCB Footprint: C0402
C24 = C: C0201; Part Number: GRM155R61E104KA87D; Part Reference: C24; Cloud IC Number: Y02110431K00; Vendor: murata; Part Name: C0201; Value: 4.7uF; PCB Footprint: C0402
C25 = C: C0402; Part Number: GRM155R61E104KA87D; Part Reference: C25; Cloud IC Number: Y02110431K00; Vendor: murata; Part Name: C0402; Value: 4.7uF; PCB Footprint: C0402
C26 = C: C0201; Part Number: GRM155R61E104KA87D; Part Reference: C26; Cloud IC Number: Y02110431K00; Vendor: murata; Part Name: C0201; Value: 1uF; PCB Footprint: C0402
C28 = C: C0201; Part Number: GRM155R61E104KA87D; Part Reference: C28; Cloud IC Number: Y02110431K00; Vendor: murata; Part Name: C0201; Value: 1uF; PCB Footprint: C0402
C29 = C: C0201; Part Number: GRM155R61E104KA87D; Part Reference: C29; Cloud IC Number: Y02110431K00; Vendor: murata; Part Name: C0201; Value: 0.1uF; PCB Footprint: C0402
C30 = C: C0201; Part Number: GRM155R61E104KA87D; Part Reference: C30; Cloud IC Number: Y02110431K00; Vendor: murata; Part Name: C0201; Value: 0.1uF; PCB Footprint: C0402
C31 = C: C0201; Part Number: GRM155R61E104KA87D; Part Reference: C31; Cloud IC Number: Y02110431K00; Vendor: murata; Part Name: C0201; Value: 1uF; PCB Footprint: C0402
C32 = C: C0201; Part Number: GRM155R61E104KA87D; Part Reference: C32; Cloud IC Number: Y02110431K00; Vendor: murata; Part Name: C0201; Value: 0.1uF; PCB Footprint: C0402
EPAD_HOLE1 = H: Part Reference: EPAD_HOLE1; Value: H1; Part Type: NC
J8 = HEADER 3X1_0.25mm: JMP_1X3_2.0; Part Number: CON_2p54_2X1; Part Reference: J8; Vendor: oupiin; Cloud IC Number: Y04C10202105; Value: Header_M / 3X1 /1.25mm; PCB Footprint: JMP_1X3_1D27; Part Name: JMP_1X3_2.0
R1 = R_Dup1: R0201; Part Reference: R1; Value: 0R; PCB Footprint: R0402; Part Name: R0201
R6 = R_Dup1: R0402; Part Reference: R6; Manufacturer Part number: Y01102201F00; Value: 4.7K; PCB Footprint: R0402; Part Name: R0402; Part Number: Y01102201F00
R7 = R_Dup1: R0402; Part Reference: R7; Manufacturer Part number: Y01102201F00; Value: 4.7K; PCB Footprint: R0402; Part Name: R0402; Part Number: Y01102201F00
R8 = R_Dup2: Part Reference: R8; Value: 1M; PCB Footprint: R0402
R11 = R_Dup1: R0402; Part Reference: R11; Manufacturer Part number: Y01104731F00; Value: NC/4.7K; PCB Footprint: R0402; Part Number: Y01104731F00; Part Name: R0402
R14 = R_Dup1: R0402; Part Reference: R14; Manufacturer Part number: Y01104731F00; Value: NC/4.7K; Part Number: Y01104731F00; Part Name: R0402; PCB Footprint: R0402
R15 = R_Dup1: R0402; Part Reference: R15; Part Number: Y01104731F00; Value: 4.7K; PCB Footprint: R0402; Part Name: R0402; Manufacturer Part number: Y01104731F00
R16 = R: R0402; Part Reference: R16; Value: NC_4.7K; PCB Footprint: R0402
R18 = R_Dup1: R0402; Part Reference: R18; Value: 30K/1%; PCB Footprint: R0402
R19 = R_Dup2: Part Reference: R19; Value: 4.7K; PCB Footprint: R0402
R20 = R_Dup1: R1206; Part Reference: R20; Value: 10K/1%; PCB Footprint: R0402; Part Name: R1206
U1 = Mars_CV181XC_QFN88: Part Reference: U1; SWAP_INFO: (S1+S2+S3+S4+S5+S6+S7); SPLIT_INST: TRUE; Value: CV181xC_QFN88; PCB Footprint: QFN88_9D0X9D0_0D35_E
Y1 = XTAL_25MHz_7: 25MHZ,3225 4PIN,SMT,12pF; Manufacturer: Taitien; Part Number: XXCBBCNANF-33.33MHz; Part Reference: Y1; Cloud IC Number: Y07425003120; BY: DTRUONG-www.amcc.com-02Apr10; MFG1: AVX; PACKAGE: 3M2X2M5x0M9; Value: 25MHz/12.5pF

## Sheet 05_SYS_Power.SchDoc
size 563 x 304 mm; DsnPath: C:\Users\nilot\Documents\VSCode\SBC\imports\SG2002_QFN88_38_20230301_4L_V1.3_16.2.DSN; SchematicName: CV181xC_QFN88_38_DemoBoard; PageName: 05_SYS_Power; PageSize: Custom; TopSchematic: True
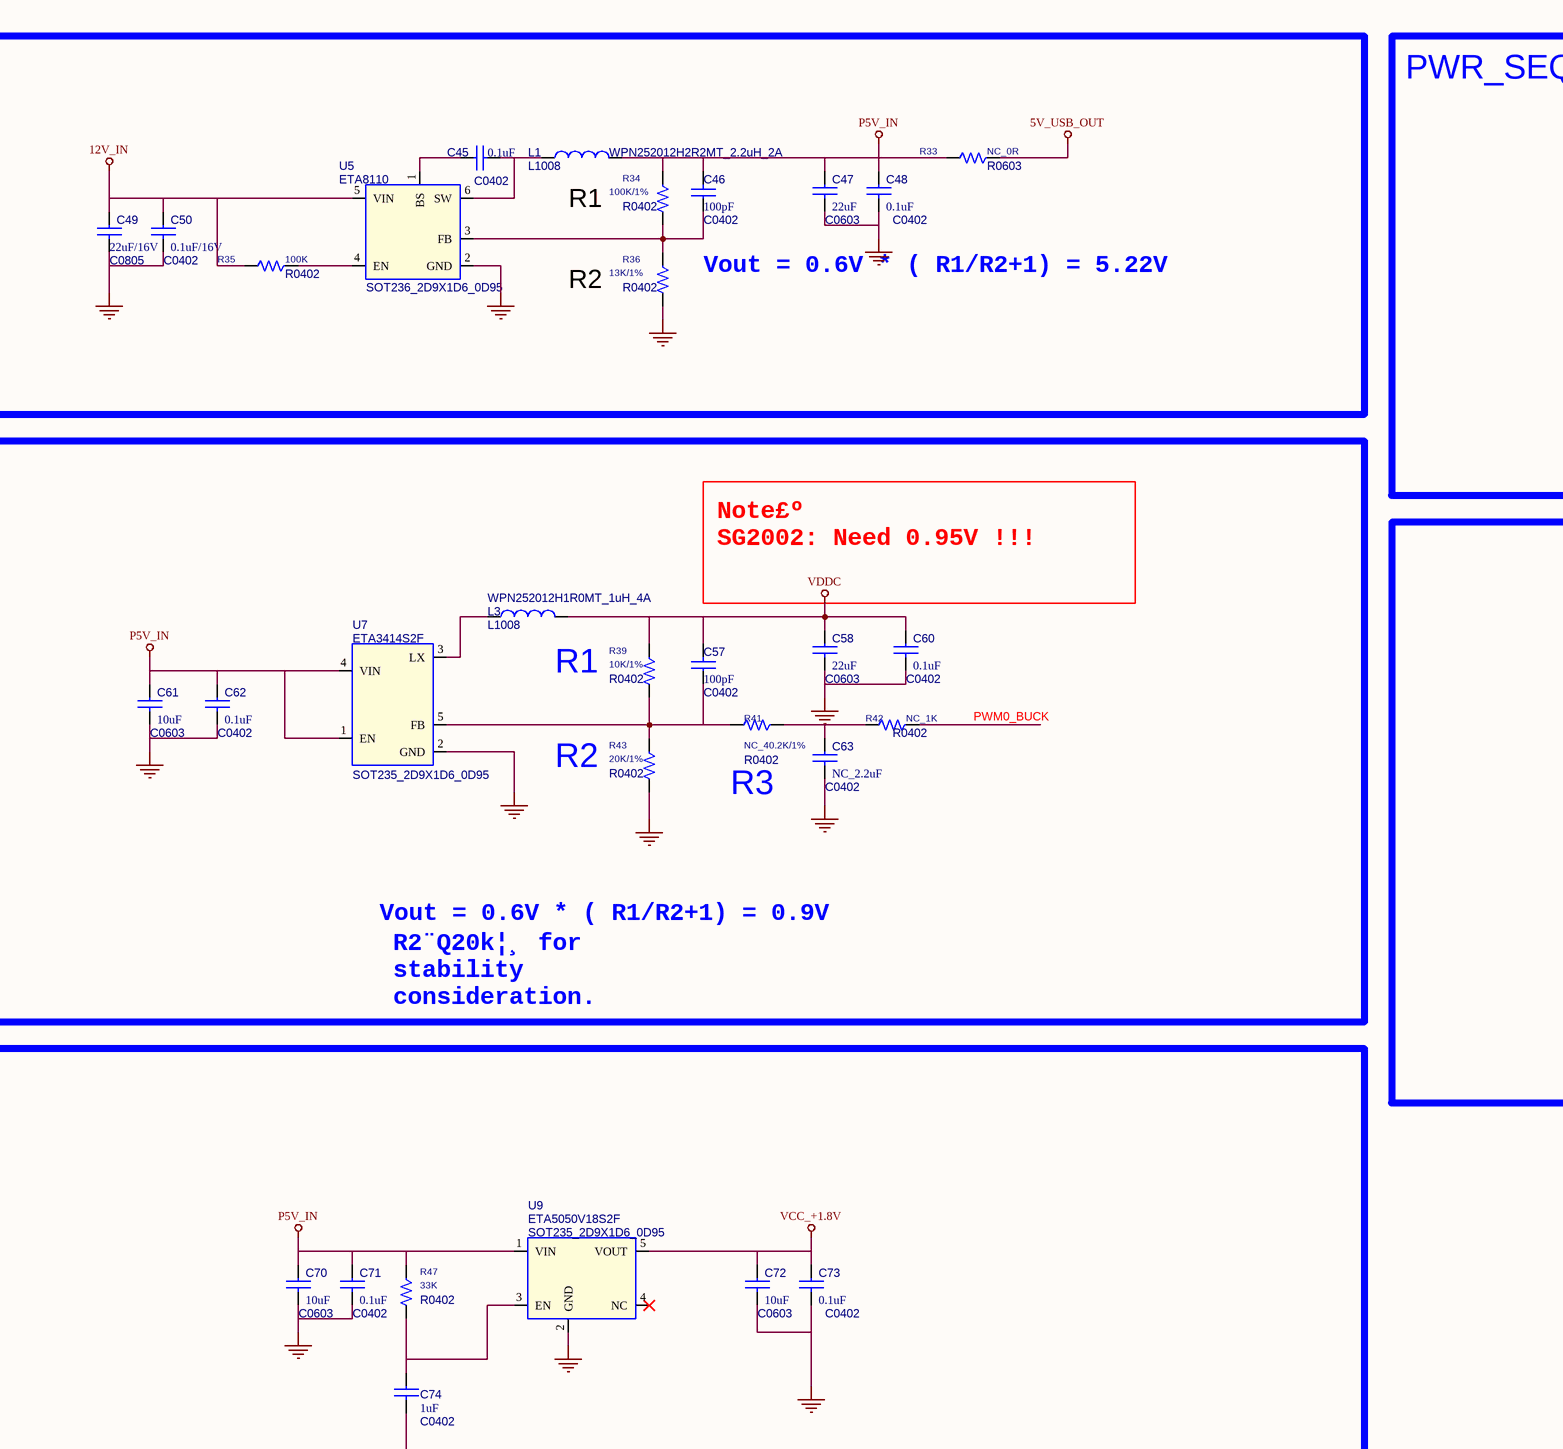
[diagram p5: 05_SYS_Power.SchDoc, top left]
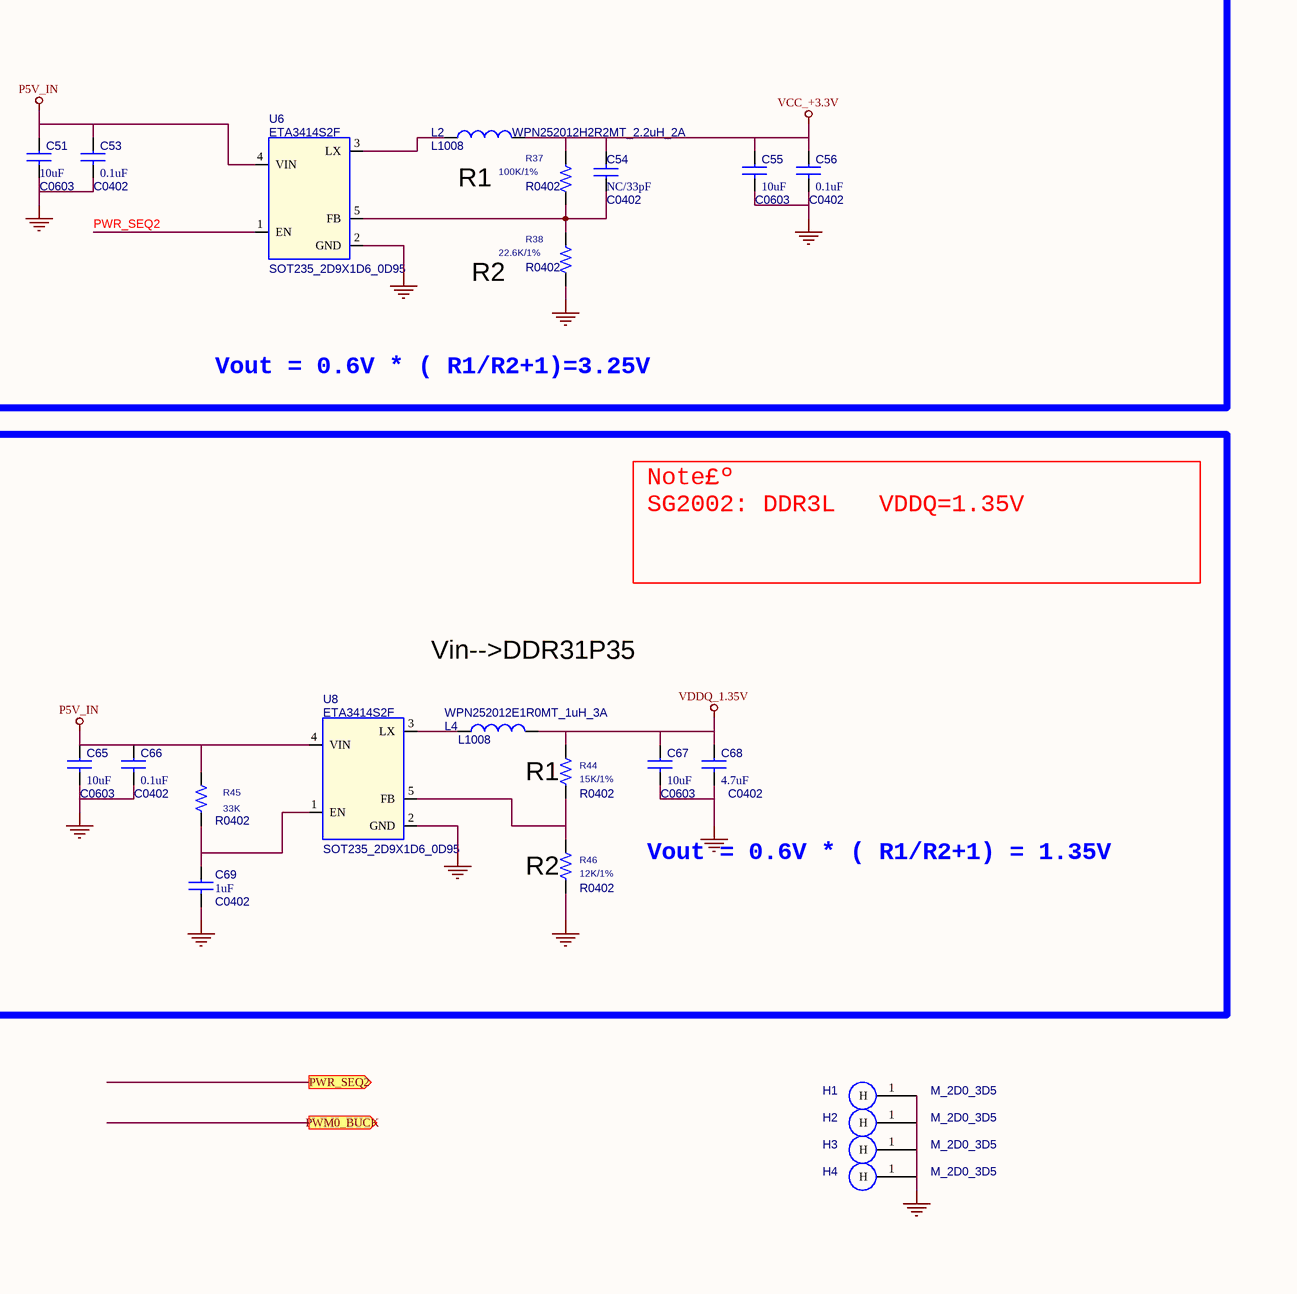
[diagram p6: 05_SYS_Power.SchDoc, top middle]
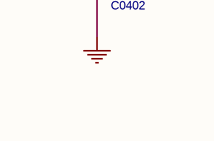
[diagram p7: 05_SYS_Power.SchDoc, centre left]
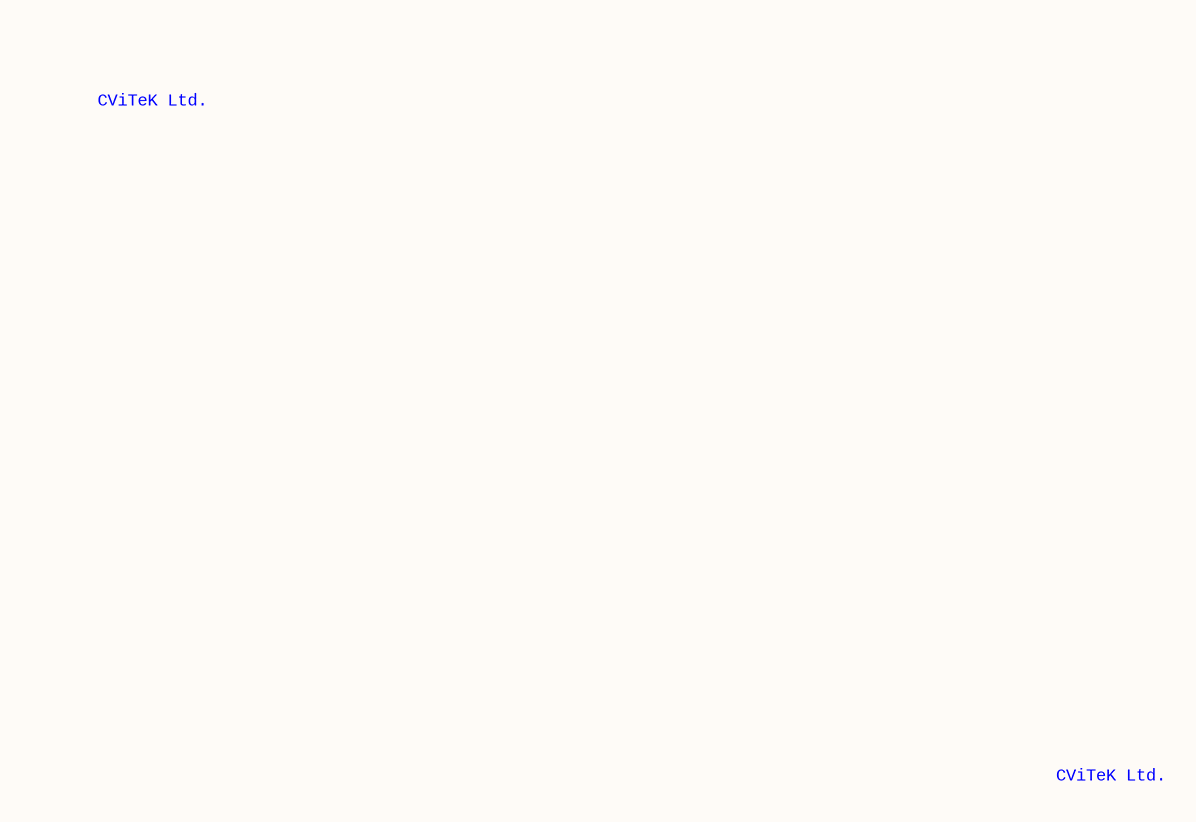
[diagram p8: 05_SYS_Power.SchDoc, bottom right]

### Parts
C45  0.1uF  [C0402]
C46  100pF  [C0402]
C47  22uF  [C0603]
C48  0.1uF  [C0402]
C49  22uF/16V  [C0805]
C50  0.1uF/16V  [C0402]
C51  10uF  [C0603]
C53  0.1uF  [C0402]
C54  NC/33pF  [C0402]
C55  10uF  [C0603]
C56  0.1uF  [C0402]
C57  100pF  [C0402]
C58  22uF  [C0603]
C60  0.1uF  [C0402]
C61  10uF  [C0603]
C62  0.1uF  [C0402]
C63  NC_2.2uF  [C0402]
C65  10uF  [C0603]
C66  0.1uF  [C0402]
C67  10uF  [C0603]
C68  4.7uF  [C0402]
C69  1uF  [C0402]
C70  10uF  [C0603]
C71  0.1uF  [C0402]
C72  10uF  [C0603]
C73  0.1uF  [C0402]
C74  1uF  [C0402]
H1  PCB Footprint: M_2D0_3D5  [M3_5.5X7.0_3.5]  (hidden comment: H1)
H2  PCB Footprint: M_2D0_3D5  [M3_5.5X7.0_3.5]  (hidden comment: H1)
H3  PCB Footprint: M_2D0_3D5  [M3_5.5X7.0_3.5]  (hidden comment: H1)
H4  PCB Footprint: M_2D0_3D5  [M3_5.5X7.0_3.5]  (hidden comment: H1)
L1  WPN252012H2R2MT_2.2uH_2A  PCB Footprint: L1008  [DISC/.350x.175/LS.200x.100/.034]
L2  WPN252012H2R2MT_2.2uH_2A  PCB Footprint: L1008  [DISC/.350x.175/LS.200x.100/.034]
L3  WPN252012H1R0MT_1uH_4A  PCB Footprint: L1008  [DISC/.350x.175/LS.200x.100/.034]
L4  WPN252012E1R0MT_1uH_3A  PCB Footprint: L1008  [DISC/.350x.175/LS.200x.100/.034]
R33  NC_0R  [R0603]
R34  100K/1%  [R0402]
R35  100K  [R0402]
R36  13K/1%  [R0402]
R37  100K/1%  [R0402]
R38  22.6K/1%  [R0402]
R39  10K/1%  [R0402]
R41  NC_40.2K/1%  [R0402]
R42  NC_1K  [R0402]
R43  20K/1%  [R0402]
R44  15K/1%  [R0402]
R45  33K  [R0402]
R46  12K/1%  [R0402]
R47  33K  [R0402]
U5  ETA8110  [SOT236_2D9X1D6_0D95]
U6  ETA3414S2F  [SOT235_2D9X1D6_0D95]
U7  ETA3414S2F  [SOT235_2D9X1D6_0D95]
U8  ETA3414S2F  [SOT235_2D9X1D6_0D95]
U9  ETA5050V18S2F  [SOT235_2D9X1D6_0D95]

### Blocks framed on the sheet
PWR_SEQ02: C51 C53-C56 L2 R37 R38 U6

### Ports
PWM0_BUCK (out), PWR_SEQ2 (out)

### Nets
5V_USB_OUT: R33.1
12V_IN: C49.1 C50.1 R35.2 U5.5(VIN)
GND: C47.2 C48.2 C49.2 C50.2 C51.2 C53.2 C55.2 C56.2 C58.2 C60.2 C61.2 C62.2 C63.2 C65.2 C66.2 C67.2 C68.2 C69.2 C70.2 C71.2 C72.2 C73.2 C74.2 H1.1(H) H2.1(H) H3.1(H) H4.1(H) R36.2 R38.2 R43.2 R46.1 U5.2(GND) U6.2(GND) U7.2(GND) U8.2(GND) U9.2(GND)  [project net MIC1_GND]
P5V_IN: C46.2 C47.1 C48.1 C51.1 C53.1 C61.1 C62.1 C65.1 C66.1 C70.1 C71.1 L1.2 R33.2 R34.1 R45.2 R47.1 U6.4(VIN) U7.1(EN) U7.4(VIN) U8.4(VIN) U9.1(VIN)
VCC_+1.8V: C72.1 C73.1 U9.5(VOUT)  [project net PWR_RSTN]
VCC_+3.3V: C54.2 C55.1 C56.1 L2.2 R37.1  [project net SPI_VCC]
VDDC: C57.2 C58.1 C60.1 L3.2 R39.1
VDDQ_1.35V: C67.1 C68.1 L4.2 R44.2
PWM0_BUCK: R42.1
PWR_SEQ2: U6.1(EN)
NetC45_1: C45.1 U5.1(BS)
NetC45_2: C45.2 L1.1 U5.6(SW)
NetC46_1: C46.1 R34.2 R36.1 U5.3(FB)
NetC54_1: C54.1 R37.2 R38.1 U6.5(FB)
NetC57_1: C57.1 R39.2 R41.2 R43.1 U7.5(FB)
NetC63_1: C63.1 R41.1 R42.2
NetC69_1: C69.1 R45.1 U8.1(EN)
NetC74_1: C74.1 R47.2 U9.3(EN)
NetL2_1: L2.1 U6.3(LX)
NetL3_1: L3.1 U7.3(LX)
NetL4_1: L4.1 U8.3(LX)
NetR35_1: R35.1 U5.4(EN)
NetR44_1: R44.1 R46.2 U8.5(FB)

Not connected (* = marked no-connect by the designer): U9 4(NC)*

### Notes on the sheet
- (near L1) R1
- R2
- Vout = 0.6V * ( R1/R2+1) = 5.22V
- (near L2) R1
- Note£º
  SG2002: Need 0.95V !!!
- Vout = 0.6V * ( R1/R2+1)=3.25V
- Note£º
  SG2002: DDR3L   VDDQ=1.35V
- (near L3) R1
- Vin-->DDR31P35
- R3
- (near R44) R1
- Vout = 0.6V * ( R1/R2+1) = 0.9V
- R2¨Q20k¦¸ for
  stability
  consideration.
- (near R46) R2
- Vout = 0.6V * ( R1/R2+1) = 1.35V
- CViTeK Ltd.

### Library data of the parts
C45 = C: C0402; Part Name: sC0402; Part Number: GRM155R61E104KA87D; Part Reference: C45; Cloud IC Number: Y02110431K00; Vendor: murata; Value: 0.1uF; PCB Footprint: C0402
C46 = C: C0402; Part Name: sC0402; Part Number: GRM155R61E104KA87D; Part Reference: C46; Cloud IC Number: Y02110431K00; Vendor: murata; Value: 100pF; PCB Footprint: C0402
C47 = C: C0603; Part Number: GRM155R61E104KA87D; Part Reference: C47; Cloud IC Number: Y02110431K00; Vendor: murata; Part Name: C0603; Value: 22uF; PCB Footprint: C0603
C48 = C: C0402; Part Number: GRM155R61E104KA87D; Part Reference: C48; Cloud IC Number: Y02110431K00; Vendor: murata; Part Name: C0402; Value: 0.1uF; PCB Footprint: C0402
C49 = C: C0805; Part Number: GRM155R61E104KA87D; Part Reference: C49; Cloud IC Number: Y02110431K00; Vendor: murata; Part Name: C0805; Value: 22uF/16V; PCB Footprint: C0805
C50 = C: C0402; Part Number: GRM155R61E104KA87D; Part Reference: C50; Cloud IC Number: Y02110431K00; Vendor: murata; Part Name: C0402; Value: 0.1uF/16V; PCB Footprint: C0402
C51 = C: C0805; Part Number: GRM155R61E104KA87D; Part Reference: C51; Cloud IC Number: Y02110431K00; Vendor: murata; Part Name: C0805; Value: 10uF; PCB Footprint: C0603
C53 = C: C0402; Part Number: GRM155R61E104KA87D; Part Reference: C53; Cloud IC Number: Y02110431K00; Vendor: murata; Part Name: C0402; Value: 0.1uF; PCB Footprint: C0402
C54 = C: C0402; Part Name: sC0402; Part Number: GRM155R61E104KA87D; Part Reference: C54; Cloud IC Number: Y02110431K00; Vendor: murata; Value: NC/33pF; PCB Footprint: C0402
C55 = C: C0603; Part Number: GRM155R61E104KA87D; Part Reference: C55; Cloud IC Number: Y02110431K00; Vendor: murata; Part Name: C0603; Value: 10uF; PCB Footprint: C0603
C56 = C: C0402; Part Number: GRM155R61E104KA87D; Part Reference: C56; Cloud IC Number: Y02110431K00; Vendor: murata; Part Name: C0402; Value: 0.1uF; PCB Footprint: C0402
C57 = C: C0402; Part Name: sC0402; Part Number: GRM155R61E104KA87D; Part Reference: C57; Cloud IC Number: Y02110431K00; Vendor: murata; Value: 100pF; PCB Footprint: C0402
C58 = C: C0805; Part Number: GRM155R61E104KA87D; Part Reference: C58; Cloud IC Number: Y02110431K00; Vendor: murata; Part Name: C0805; Value: 22uF; PCB Footprint: C0603
C60 = C: C0402; Part Number: GRM155R61E104KA87D; Part Reference: C60; Cloud IC Number: Y02110431K00; Vendor: murata; Part Name: C0402; Value: 0.1uF; PCB Footprint: C0402
C61 = C: C0603; Part Number: GRM155R61E104KA87D; Part Reference: C61; Cloud IC Number: Y02110431K00; Vendor: murata; Part Name: C0603; Value: 10uF; PCB Footprint: C0603
C62 = C: C0402; Part Number: GRM155R61E104KA87D; Part Reference: C62; Cloud IC Number: Y02110431K00; Vendor: murata; Part Name: C0402; Value: 0.1uF; PCB Footprint: C0402
C63 = C: C0402; Part Number: GRM155R61E104KA87D; Part Reference: C63; Cloud IC Number: Y02110431K00; Vendor: murata; Part Name: C0402; Value: NC_2.2uF; PCB Footprint: C0402
C65 = C: C0603; Part Number: GRM155R61E104KA87D; Part Reference: C65; Cloud IC Number: Y02110431K00; Vendor: murata; Part Name: C0603; Value: 10uF; PCB Footprint: C0603
C66 = C: C0402; Part Number: GRM155R61E104KA87D; Part Reference: C66; Cloud IC Number: Y02110431K00; Vendor: murata; Part Name: C0402; Value: 0.1uF; PCB Footprint: C0402
C67 = C: C0603; Part Number: GRM155R61E104KA87D; Part Reference: C67; Cloud IC Number: Y02110431K00; Vendor: murata; Part Name: C0603; Value: 10uF; PCB Footprint: C0603
C68 = C: C0402; Part Number: GRM155R61E104KA87D; Part Reference: C68; Cloud IC Number: Y02110431K00; Vendor: murata; Part Name: C0402; Value: 4.7uF; PCB Footprint: C0402
C69 = C: C0402; Part Number: GRM155R61E104KA87D; Part Reference: C69; Cloud IC Number: Y02110431K00; Vendor: murata; Part Name: C0402; Value: 1uF; PCB Footprint: C0402
C70 = C: C0603; Part Number: GRM155R61E104KA87D; Part Reference: C70; Cloud IC Number: Y02110431K00; Vendor: murata; Part Name: C0603; Value: 10uF; PCB Footprint: C0603
C71 = C: C0402; Part Number: GRM155R61E104KA87D; Part Reference: C71; Cloud IC Number: Y02110431K00; Vendor: murata; Part Name: C0402; Value: 0.1uF; PCB Footprint: C0402
C72 = C: C0603; Part Number: GRM155R61E104KA87D; Part Reference: C72; Cloud IC Number: Y02110431K00; Vendor: murata; Part Name: C0603; Value: 10uF; PCB Footprint: C0603
C73 = C: C0402; Part Number: GRM155R61E104KA87D; Part Reference: C73; Cloud IC Number: Y02110431K00; Vendor: murata; Part Name: C0402; Value: 0.1uF; PCB Footprint: C0402
C74 = C: C0402; Part Number: GRM155R61E104KA87D; Part Reference: C74; Cloud IC Number: Y02110431K00; Vendor: murata; Part Name: C0402; Value: 1uF; PCB Footprint: C0402
H1 = H: Part Reference: H1; Value: H1; Part Type: NC
H2 = H: Part Reference: H2; Value: H1; Part Type: NC
H3 = H: Part Reference: H3; Value: H1; Part Type: NC
H4 = H: Part Reference: H4; Value: H1; Part Type: NC
L1 = L: Part Reference: L1; Part Number: 20500109; DIST: FLAT; PSpiceTemplate: L^@REFDES %1 %2 ?TOLERANCE|L^@REFDES| @VALUE ?IC/IC=@IC/ ?TOLERANCE|\n.model l^@REFDES IND L=1 DEV=@TOLERANCE%|; CURRENT: LMAX; DIELECTRIC: DSMAX; Value: WPN252012H2R2MT_2.2uH_2A
L2 = L: Part Reference: L2; Part Number: 20500109; DIST: FLAT; PSpiceTemplate: L^@REFDES %1 %2 ?TOLERANCE|L^@REFDES| @VALUE ?IC/IC=@IC/ ?TOLERANCE|\n.model l^@REFDES IND L=1 DEV=@TOLERANCE%|; CURRENT: LMAX; DIELECTRIC: DSMAX; Value: WPN252012H2R2MT_2.2uH_2A
L3 = L: Part Reference: L3; Part Number: 20500109; DIST: FLAT; PSpiceTemplate: L^@REFDES %1 %2 ?TOLERANCE|L^@REFDES| @VALUE ?IC/IC=@IC/ ?TOLERANCE|\n.model l^@REFDES IND L=1 DEV=@TOLERANCE%|; CURRENT: LMAX; DIELECTRIC: DSMAX; Value: WPN252012H1R0MT_1uH_4A
L4 = L: Part Reference: L4; Part Number: 20500109; DIST: FLAT; PSpiceTemplate: L^@REFDES %1 %2 ?TOLERANCE|L^@REFDES| @VALUE ?IC/IC=@IC/ ?TOLERANCE|\n.model l^@REFDES IND L=1 DEV=@TOLERANCE%|; CURRENT: LMAX; DIELECTRIC: DSMAX; Value: WPN252012E1R0MT_1uH_3A
R33 = R_Dup2: Part Reference: R33; Value: NC_0R; PCB Footprint: R0603
R34 = R_Dup2: Part Reference: R34; Value: 100K/1%; PCB Footprint: R0402
R35 = R_Dup2: Part Reference: R35; Value: 100K; PCB Footprint: R0402
R36 = R_Dup2: Part Reference: R36; Value: 13K/1%; PCB Footprint: R0402
R37 = R_Dup2: Part Reference: R37; Value: 100K/1%; PCB Footprint: R0402
R38 = R_Dup2: Part Reference: R38; Value: 22.6K/1%; PCB Footprint: R0402
R39 = R_Dup2: Part Reference: R39; Value: 10K/1%; PCB Footprint: R0402
R41 = R_Dup1: R0402; Part Reference: R41; Value: NC_40.2K/1%; PCB Footprint: R0402
R42 = R_Dup1: R1206; Part Reference: R42; Value: NC_1K; PCB Footprint: R0402; Part Name: R1206
R43 = R_Dup2: Part Reference: R43; Value: 20K/1%; PCB Footprint: R0402
R44 = R_Dup1: R0402; Part Reference: R44; Value: 15K/1%; PCB Footprint: R0402
R45 = R_Dup1: R0402; Part Reference: R45; Value: 33K; PCB Footprint: R0402
R46 = R_Dup1: R0402; Part Reference: R46; Value: 12K/1%; PCB Footprint: R0402
R47 = R_Dup2: Part Reference: R47; Value: 33K; PCB Footprint: R0402
U5 = G2832TB1U_0: Part Reference: U5; Value: ETA8110; PCB Footprint: SOT236_2D9X1D6_0D95
U6 = G2822T11U_0: Part Reference: U6; Value: ETA3414S2F; PCB Footprint: SOT235_2D9X1D6_0D95
U7 = G2822T11U_0: Part Reference: U7; Value: ETA3414S2F; PCB Footprint: SOT235_2D9X1D6_0D95
U8 = G2822T11U_0: Part Reference: U8; Value: ETA3414S2F; PCB Footprint: SOT235_2D9X1D6_0D95
U9 = G9091-180T11U: Part Reference: U9; Value: ETA5050V18S2F; PCB Footprint: SOT235_2D9X1D6_0D95

## Sheet 06_eMMC_SDIO_SPINAND_SPINOR.SchDoc
size 363 x 215 mm; DsnPath: C:\Users\nilot\Documents\VSCode\SBC\imports\SG2002_QFN88_38_20230301_4L_V1.3_16.2.DSN; SchematicName: CV181xC_QFN88_38_DemoBoard; PageName: 06_eMMC_SDIO_SPINAND_SPINOR; PageSize: Custom; TopSchematic: True
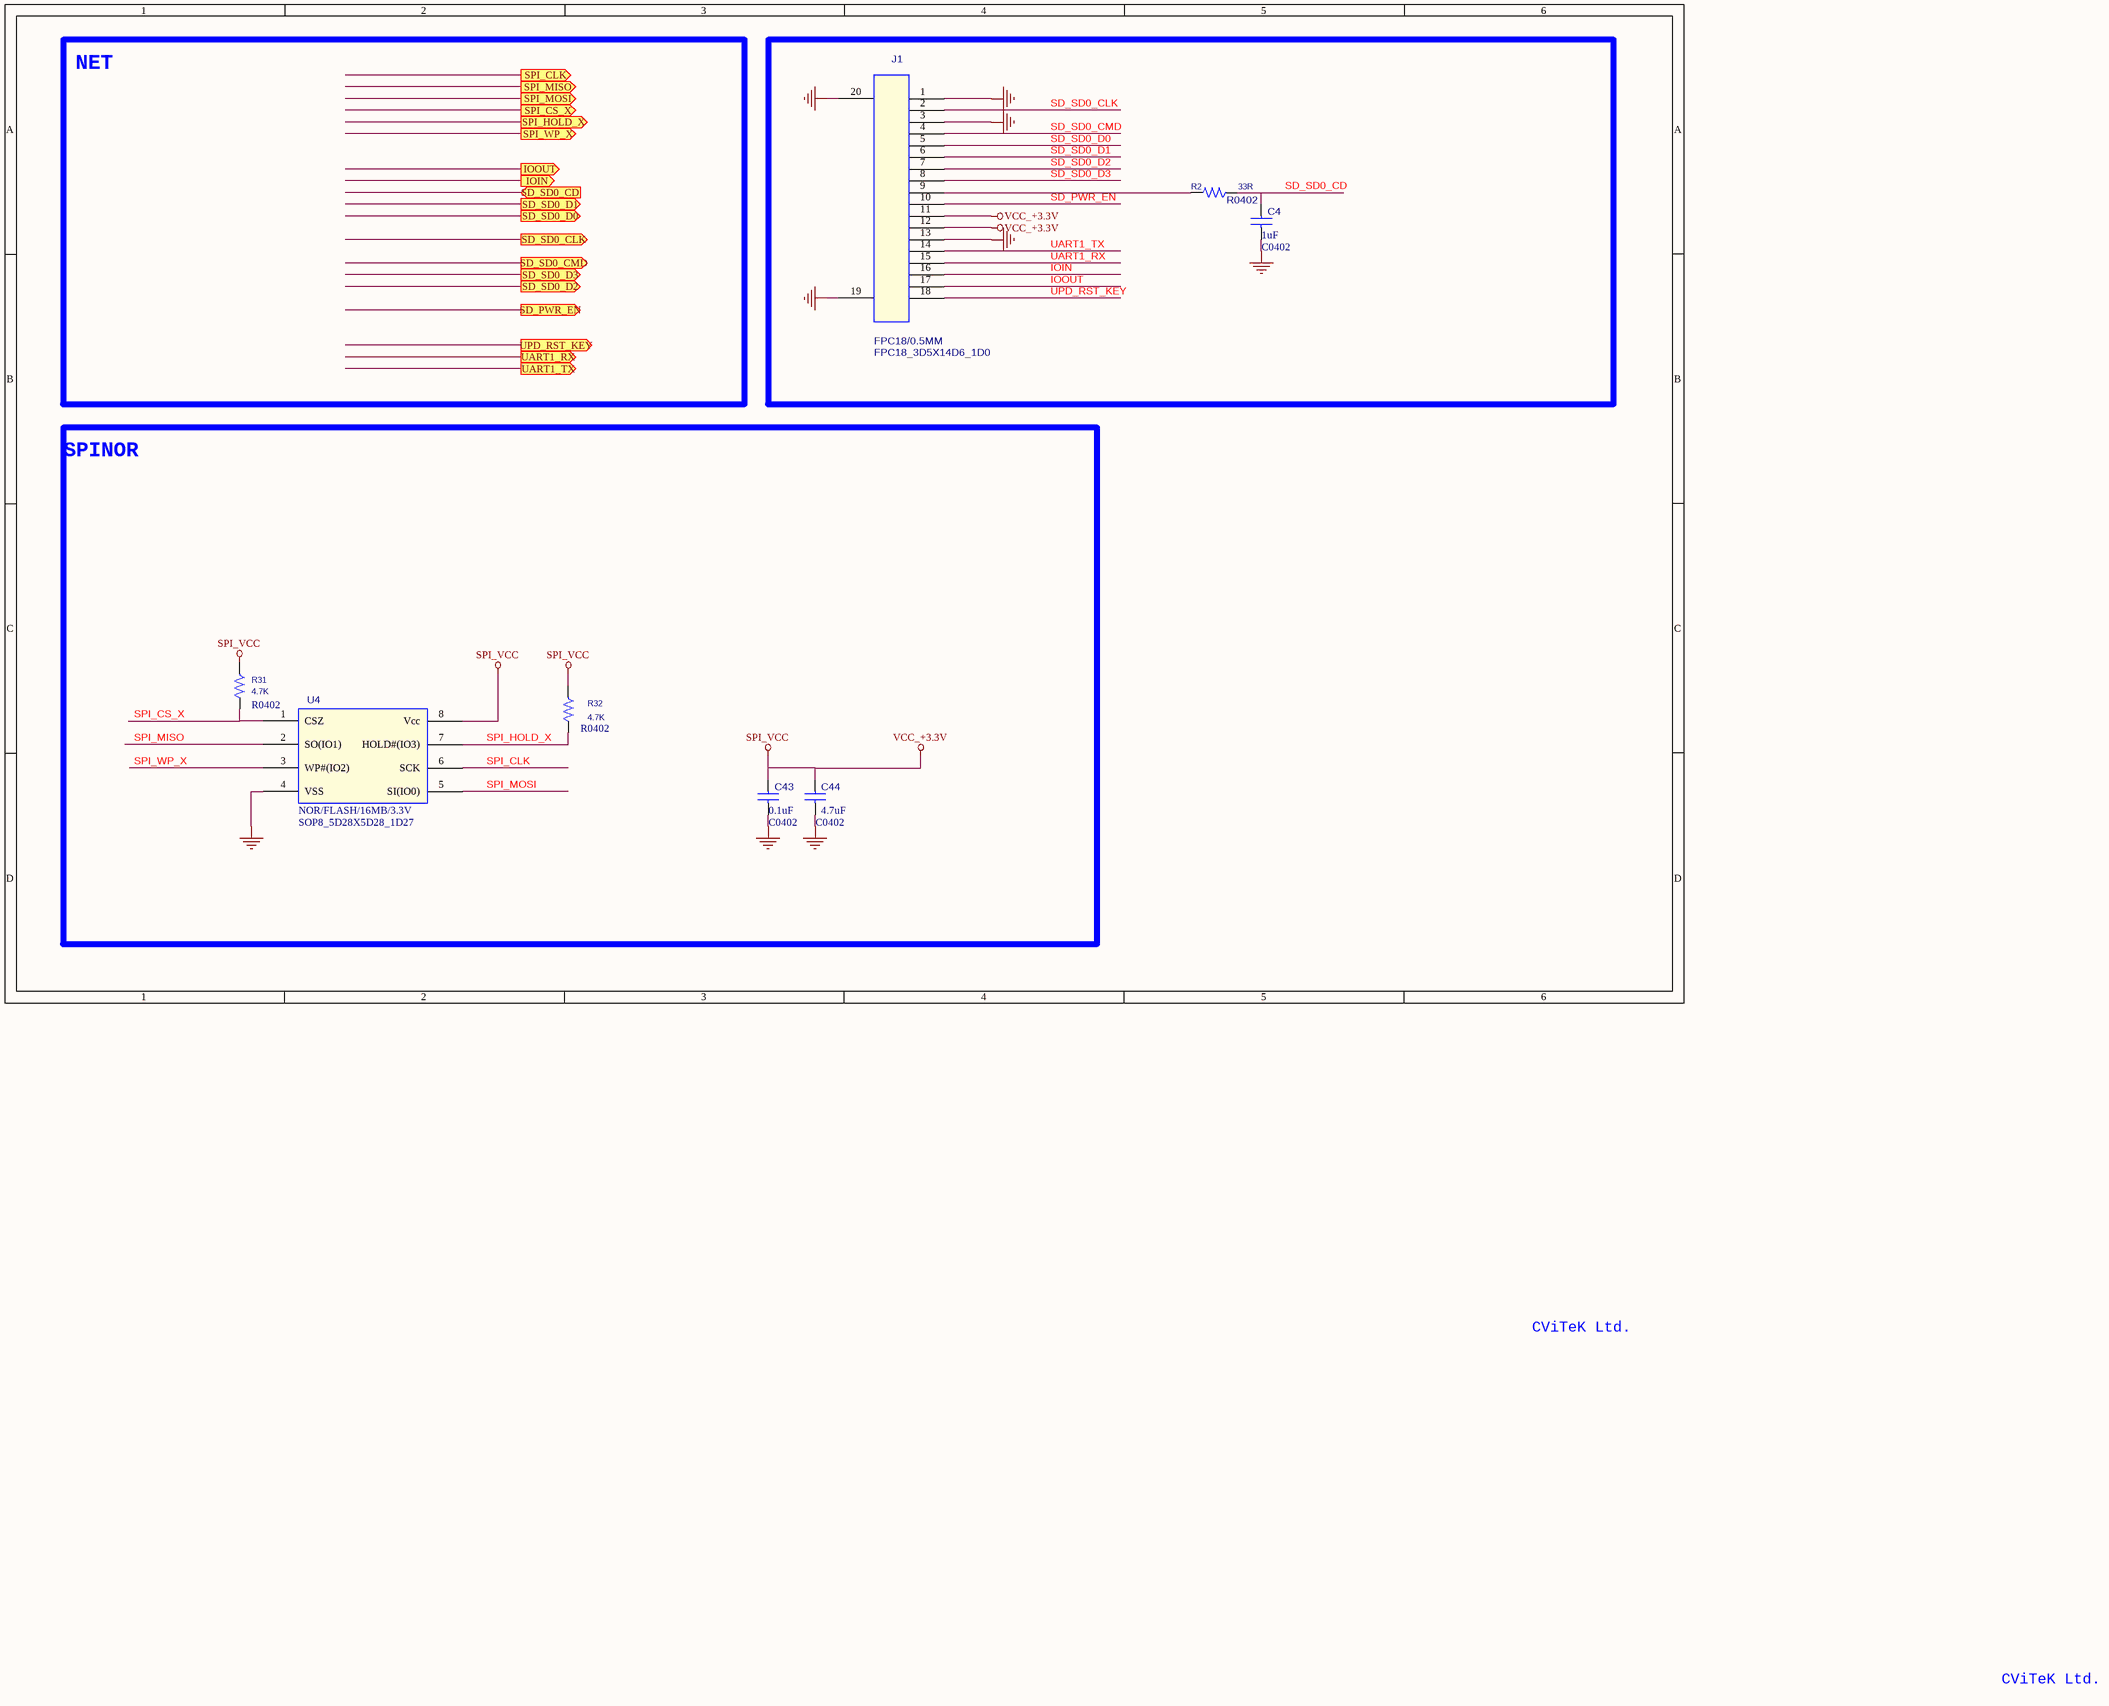
[diagram p9: 06_eMMC_SDIO_SPINAND_SPINOR.SchDoc]

### Parts
C4  1uF  [C0402]
C43  0.1uF  [C0402]
C44  4.7uF  [C0402]
J1  FPC18/0.5MM  [FPC18_3D5X14D6_1D0]
R2  33R  [R0402]
R31  4.7K  [R0402]
R32  4.7K  [R0402]
U4  NOR/FLASH/16MB/3.3V  PCB Footprint: SOP8_5D28X5D28_1D27  [BGA4-0_5-0202-1X1]

### Blocks framed on the sheet
SPINOR: C43 C44 R31 R32 U4

### Ports
IOIN (out), IOOUT (out), SD_PWR_EN (out), SD_SD0_CD (in), SD_SD0_CLK (out), SD_SD0_CMD (out), SD_SD0_D0 (out), SD_SD0_D1 (out), SD_SD0_D2 (out), SD_SD0_D3 (out), SPI_CLK (out), SPI_CS_X (out), SPI_HOLD_X (out), SPI_MISO (out), SPI_MOSI (out), SPI_WP_X (out), UART1_RX (out), UART1_TX (out), UPD_RST_KEY (out)

### Nets
GND: C4.2 C43.2 C44.2 J1.1 J1.3 J1.13 J1.19 J1.20 U4.4(VSS)  [project net MIC1_GND]
SPI_VCC: C43.1 C44.1 J1.11 J1.12 R31.1 R32.1 U4.8(Vcc)  [also labelled VCC_+3.3V]
IOIN: J1.16
IOOUT: J1.17
SD_PWR_EN: J1.10
SD_SD0_CD: C4.1 R2.1
SD_SD0_CLK: J1.2
SD_SD0_CMD: J1.4
SD_SD0_D0: J1.5
SD_SD0_D1: J1.6
SD_SD0_D2: J1.7
SD_SD0_D3: J1.8
SPI_CLK: U4.6(SCK)
SPI_CS_X: R31.2 U4.1(CSZ)
SPI_HOLD_X: R32.2 U4.7(HOLD#(IO3))
SPI_MISO: U4.2(SO(IO1))
SPI_MOSI: U4.5(SI(IO0))
SPI_WP_X: U4.3(WP#(IO2))
UART1_RX: J1.15
UART1_TX: J1.14
UPD_RST_KEY: J1.18
NetJ1_9: J1.9 R2.2

### Notes on the sheet
- NET
- CViTeK Ltd.

### Library data of the parts
C4 = C: C0402; Part Number: GRM155R61E104KA87D; Part Reference: C4; Cloud IC Number: Y02110431K00; Vendor: murata; Part Name: C0402; Value: 1uF; PCB Footprint: C0402
C43 = C: C0402; Part Number: GRM155R61E104KA87D; Part Reference: C43; Cloud IC Number: Y02110431K00; Vendor: murata; Part Name: C0402; Value: 0.1uF; PCB Footprint: C0402
C44 = C: C0402; Part Number: GRM155R61E104KA87D; Part Reference: C44; Cloud IC Number: Y02110431K00; Vendor: murata; Part Name: C0402; Value: 4.7uF; PCB Footprint: C0402
J1 = CON12_0: Part Reference: J1; Value: FPC18/0.5MM; PCB Footprint: FPC18_3D5X14D6_1D0
R2 = R_Dup1: R0402; Part Reference: R2; Part Number: Y01102201F00; Value: 33R; PCB Footprint: R0402; Manufacturer Part number: Y01102201F00; Part Name: R0402
R31 = R_Dup1: R0402; Part Reference: R31; Manufacturer Part number: Y01104731F00; Value: 4.7K; Part Number: Y01104731F00; Part Name: R0402; PCB Footprint: R0402
R32 = R_Dup1: R0402; Part Reference: R32; Manufacturer Part number: Y01104731F00; Value: 4.7K; Part Number: Y01104731F00; Part Name: R0402; PCB Footprint: R0402
U4 = ESMT_SPINOR_WSON8_5: ESMT_SPINOR_8-C WSON; Part Reference: U4; NANE: SPINOR_WSON8; Value: NOR/FLASH/16MB/3.3V

## Sheet 07_USB_LED.SchDoc
size 271 x 114 mm; DsnPath: C:\Users\nilot\Documents\VSCode\SBC\imports\SG2002_QFN88_38_20230301_4L_V1.3_16.2.DSN; SchematicName: CV181xC_QFN88_38_DemoBoard; PageName: 07_USB_LED; PageSize: Custom; TopSchematic: True
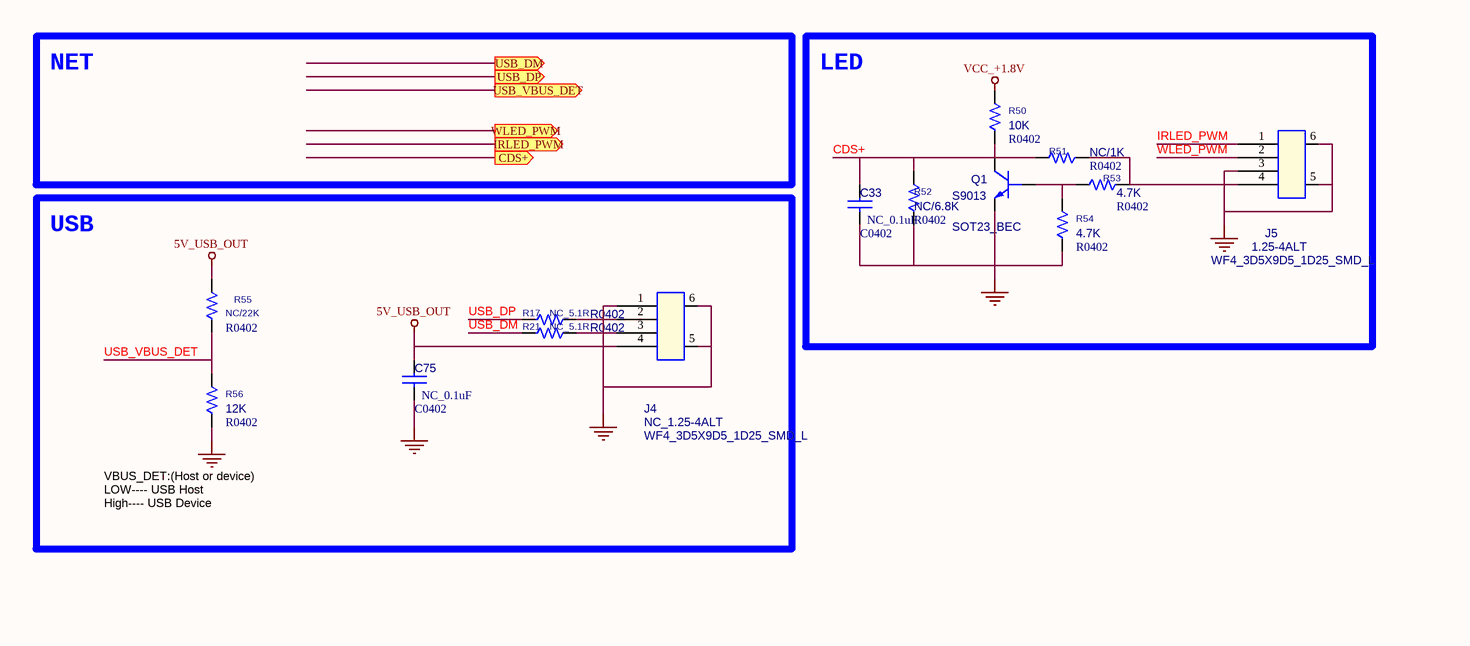
[diagram p10: 07_USB_LED.SchDoc, top left]
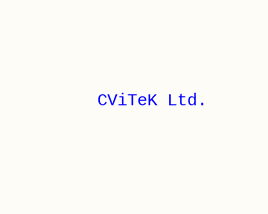
[diagram p11: 07_USB_LED.SchDoc, centre middle]
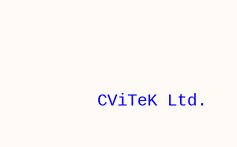
[diagram p12: 07_USB_LED.SchDoc, bottom right]

### Parts
C33  NC_0.1uF  [C0402]
C75  NC_0.1uF  [C0402]
J4  NC_1.25-4ALT  [WF4_3D5X9D5_1D25_SMD_L]
J5  1.25-4ALT  [WF4_3D5X9D5_1D25_SMD_L]
Q1  S9013  [SOT23_BEC]
R17  NC_5.1R  [R0402]
R21  NC_5.1R  [R0402]
R50  10K  [R0402]
R51  NC/1K  [R0402]
R52  NC/6.8K  [R0402]
R53  4.7K  [R0402]
R54  4.7K  [R0402]
R55  NC/22K  [R0402]
R56  12K  [R0402]

### Blocks framed on the sheet
LED: C33 J5 Q1 R50-R54
USB: C75 J4 R17 R21 R55 R56

### Ports
CDS+ (out), IRLED_PWM (out), USB_DM (out), USB_DP (out), USB_VBUS_DET (out), WLED_PWM (out)

### Nets
5V_USB_OUT: C75.1 J4.4 R55.2
GND: C33.2 C75.2 J4.1 J4.5 J4.6 J5.3 J5.5 J5.6 Q1.E R52.1 R54.1 R56.1  [project net MIC1_GND]
VCC_+1.8V: R50.2  [project net PWR_RSTN]
CDS+: C33.1 Q1.C R50.1 R51.2 R52.2
IRLED_PWM: J5.1
USB_DM: R21.1
USB_DP: R17.1
USB_VBUS_DET: R55.1 R56.2
WLED_PWM: J5.2
NetJ4_2: J4.2 R17.2
NetJ4_3: J4.3 R21.2
NetJ5_4: J5.4 R51.1 R53.1
NetQ1_B: Q1.B R53.2 R54.2

### Notes on the sheet
- NET
- VBUS_DET:(Host or device)
  LOW---- USB Host
  High---- USB Device
- CViTeK Ltd.

### Library data of the parts
C33 = C: C0402; Part Number: GRM155R61E104KA87D; Part Reference: C33; Cloud IC Number: Y02110431K00; Vendor: murata; Part Name: C0402; Value: NC_0.1uF; PCB Footprint: C0402
C75 = C: C0402; Part Number: GRM155R61E104KA87D; Part Reference: C75; Cloud IC Number: Y02110431K00; Vendor: murata; Part Name: C0402; Value: NC_0.1uF; PCB Footprint: C0402
J4 = CON6_6: Part Reference: J4; Value: NC_1.25-4ALT; PCB Footprint: WF4_3D5X9D5_1D25_SMD_L
J5 = CON6_6: Part Reference: J5; Value: 1.25-4ALT; PCB Footprint: WF4_3D5X9D5_1D25_SMD_L
Q1 = 2N1069_4: S9013 SOT-23; Part Reference: Q1; Part Number: Y061S9013206; PspiceTemplate: Q^@REFDES %C %B %E; Value: S9013; Manufacturer Part number: Y061S9013206; PCB Footprint: SOT23_BEC
R17 = R_Dup2: Part Reference: R17; Value: NC_5.1R; PCB Footprint: R0402
R21 = R_Dup2: Part Reference: R21; Value: NC_5.1R; PCB Footprint: R0402
R50 = R_Dup1: R0402; Part Reference: R50; Manufacturer Part number: Y01101041F00; Accuracy: 1%; Vendor: yageo; Value: 10K; Part Name: R0402; Part Type: RES; Part Number: Y01101041F00; PCB Footprint: R0402
R51 = R_Dup1: R0402; Part Reference: R51; Manufacturer Part number: Y01101041F00; Accuracy: 1%; Vendor: yageo; Value: NC/1K; Part Name: R0402; Part Type: RES; Part Number: Y01101041F00; PCB Footprint: R0402
R52 = R_Dup1: R0402; Part Reference: R52; Manufacturer Part number: Y01101041F00; Accuracy: 1%; Vendor: yageo; Value: NC/6.8K; Part Name: R0402; Part Type: RES; Part Number: Y01101041F00; PCB Footprint: R0402
R53 = R_Dup1: R0402; Part Reference: R53; Part Number: Y01101041F00; Vendor: yageo; Accuracy: 1%; Value: 4.7K; Part Type: RES; Manufacturer Part number: Y01101041F00; Part Name: R0402; PCB Footprint: R0402
R54 = R_Dup1: R0402; Part Reference: R54; Manufacturer Part number: Y01101041F00; Accuracy: 1%; Vendor: yageo; Value: 4.7K; Part Name: R0402; Part Type: RES; Part Number: Y01101041F00; PCB Footprint: R0402
R55 = R_Dup1: R0402; Part Reference: R55; Value: NC/22K; PCB Footprint: R0402
R56 = R_Dup1: R0402; Part Reference: R56; Part Number: Y01101041F00; Vendor: yageo; Accuracy: 1%; Value: 12K; PCB Footprint: R0402; Part Type: RES; Manufacturer Part number: Y01101041F00; Part Name: R0402

## Sheet 08_RJ45.SchDoc
size 322 x 137 mm; DsnPath: C:\Users\nilot\Documents\VSCode\SBC\imports\SG2002_QFN88_38_20230301_4L_V1.3_16.2.DSN; SchematicName: CV181xC_QFN88_38_DemoBoard; PageName: 08_RJ45; PageSize: Custom; TopSchematic: True
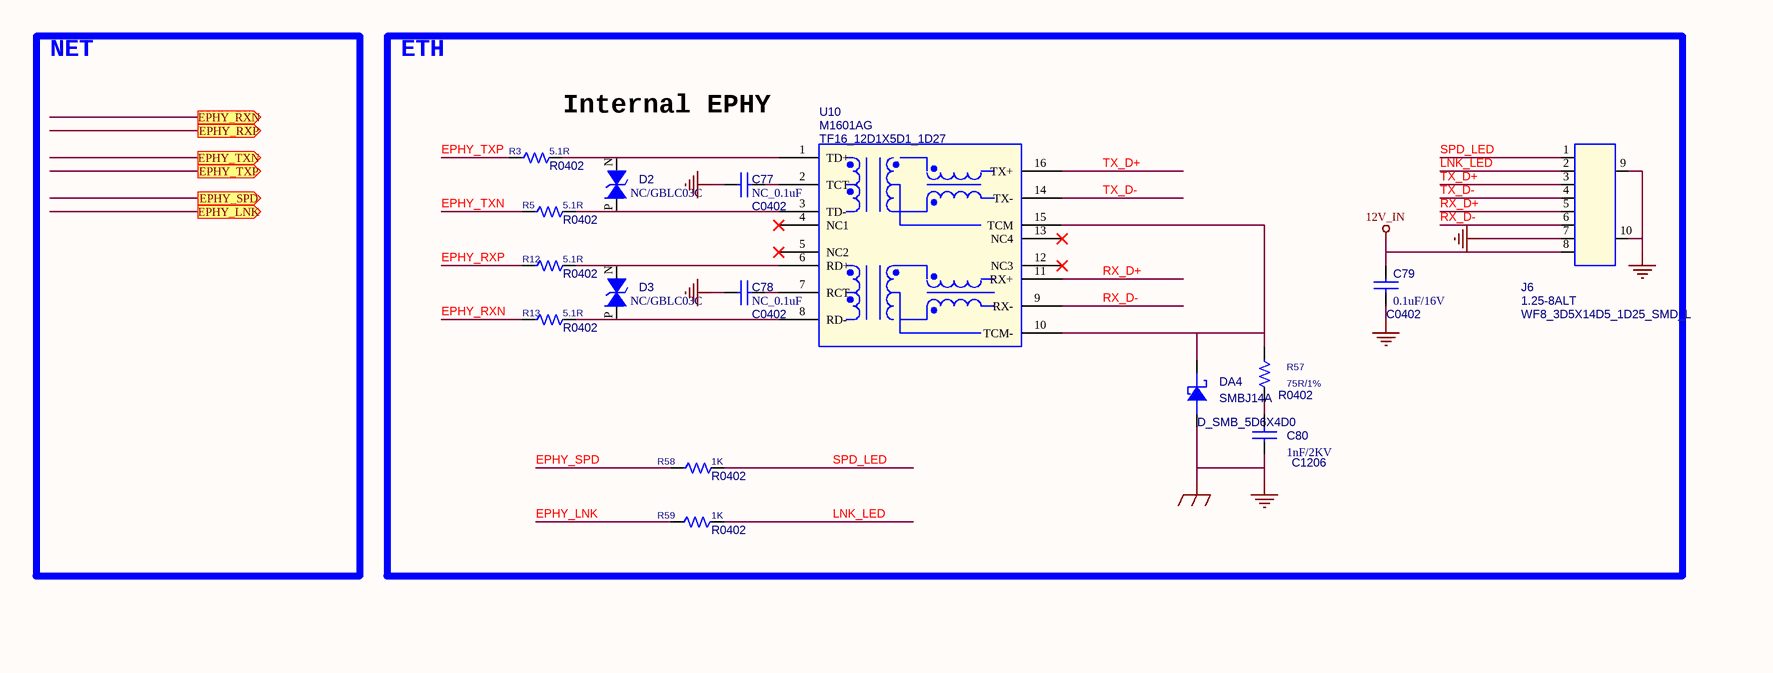
[diagram p13: 08_RJ45.SchDoc, top left]
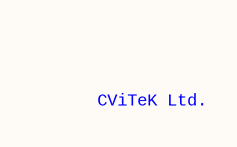
[diagram p14: 08_RJ45.SchDoc, bottom right]

### Parts
C77  NC_0.1uF  [C0402]
C78  NC_0.1uF  [C0402]
C79  0.1uF/16V  [C0402]
C80  1nF/2KV  [C1206]
D2  NC/GBLC03C  [SOD323_1D4X1D8]
D3  NC/GBLC03C  [SOD323_1D4X1D8]
DA4  SMBJ14A  [D_SMB_5D6X4D0]
J6  1.25-8ALT  [WF8_3D5X14D5_1D25_SMD_L]
R3  5.1R  [R0402]
R5  5.1R  [R0402]
R12  5.1R  [R0402]
R13  5.1R  [R0402]
R57  75R/1%  [R0402]
R58  1K  [R0402]
R59  1K  [R0402]
U10  M1601AG  [TF16_12D1X5D1_1D27]

### Ports
EPHY_LNK (out), EPHY_RXN (out), EPHY_RXP (out), EPHY_SPD (out), EPHY_TXN (out), EPHY_TXP (out)

### Nets
12V_IN: C79.1 J6.8
CHASSI_GND: C77.1 C78.1 C79.2 C80.1 DA4.P J6.7 J6.9 J6.10  [also labelled GND]  [project net MIC1_GND]
EPHY_LNK: R59.2
EPHY_RXN: R13.1
EPHY_RXP: R12.1
EPHY_SPD: R58.1
EPHY_TXN: R5.1
EPHY_TXP: R3.1
LNK_LED: J6.2 R59.1
RX_D+: J6.5 U10.11(RX+)
RX_D-: J6.6 U10.9(RX-)
SPD_LED: J6.1 R58.2
TX_D+: J6.3 U10.16(TX+)
TX_D-: J6.4 U10.14(TX-)
NetC77_2: C77.2 U10.2(TCT)
NetC78_2: C78.2 U10.7(RCT)
NetC80_2: C80.2 R57.2
NetD2_N: D2.N R3.2 U10.1(TD+)
NetD2_P: D2.P R5.2 U10.3(TD-)
NetD3_N: D3.N R12.2 U10.6(RD+)
NetD3_P: D3.P R13.2 U10.8(RD-)
NetDA4_N: DA4.N R57.1 U10.10(TCM-) U10.15(TCM)

Not connected (* = marked no-connect by the designer): U10 4(NC1)* 5(NC2)* 12(NC3)* 13(NC4)*

### Notes on the sheet
- NET
- ETH
- Internal EPHY
- CViTeK Ltd.

### Library data of the parts
C77 = C: ÌùÆ¬µçÈÝ CAP CER 0.1UF 16V 10% X7R 0402; Part Name: sC0402; Part Reference: C77; Cloud IC Number: Y02110431K00; Vendor: murata; Value: NC_0.1uF; PCB Footprint: C0402
C78 = C: ÌùÆ¬µçÈÝ CAP CER 0.1UF 16V 10% X7R 0402; Part Name: sC0402; Part Reference: C78; Cloud IC Number: Y02110431K00; Vendor: murata; Value: NC_0.1uF; PCB Footprint: C0402
C79 = C: C0402; Part Number: GRM155R61E104KA87D; Part Reference: C79; Cloud IC Number: Y02110431K00; Vendor: murata; Part Name: C0402; Value: 0.1uF/16V; PCB Footprint: C0402
C80 = C: C1206; Part Number: GRM155R61E104KA87D; Part Reference: C80; Cloud IC Number: Y02110431K00; Vendor: murata; Part Name: C1206; Value: 1nF/2KV; PCB Footprint: C1206
D2 = D_0: Part Number: 025-0402ML2R5-000; Part Reference: D2; Price: 0.07; Value: NC/GBLC03C; PCB Footprint: SOD323_1D4X1D8
D3 = D_0: Part Number: 025-0402ML2R5-000; Part Reference: D3; Price: 0.07; Value: NC/GBLC03C; PCB Footprint: SOD323_1D4X1D8
DA4 = DIODE SCHOTTKY_0: Part Reference: DA4; Value: SMBJ14A; PCB Footprint: D_SMB_5D6X4D0
J6 = CON6_2: Part Reference: J6; Value: 1.25-8ALT; PCB Footprint: WF8_3D5X14D5_1D25_SMD_L
R3 = R_Dup2: Part Reference: R3; Value: 5.1R; PCB Footprint: R0402
R5 = R_Dup2: Part Reference: R5; Value: 5.1R; PCB Footprint: R0402
R12 = R_Dup2: Part Reference: R12; Value: 5.1R; PCB Footprint: R0402
R13 = R_Dup2: Part Reference: R13; Value: 5.1R; PCB Footprint: R0402
R57 = R_Dup2: Part Reference: R57; Value: 75R/1%; PCB Footprint: R0402
R58 = R_Dup2: Part Reference: R58; Value: 1K; PCB Footprint: R0402
R59 = R_Dup2: Part Reference: R59; Value: 1K; PCB Footprint: R0402
U10 = M1601AG: Part Reference: U10; Value: M1601AG; PCB Footprint: TF16_12D1X5D1_1D27

## Sheet 09_AUDIO.SchDoc
size 287 x 157 mm; DsnPath: C:\Users\nilot\Documents\VSCode\SBC\imports\SG2002_QFN88_38_20230301_4L_V1.3_16.2.DSN; SchematicName: CV181xC_QFN88_38_DemoBoard; PageName: 09_AUDIO; PageSize: Custom; TopSchematic: True
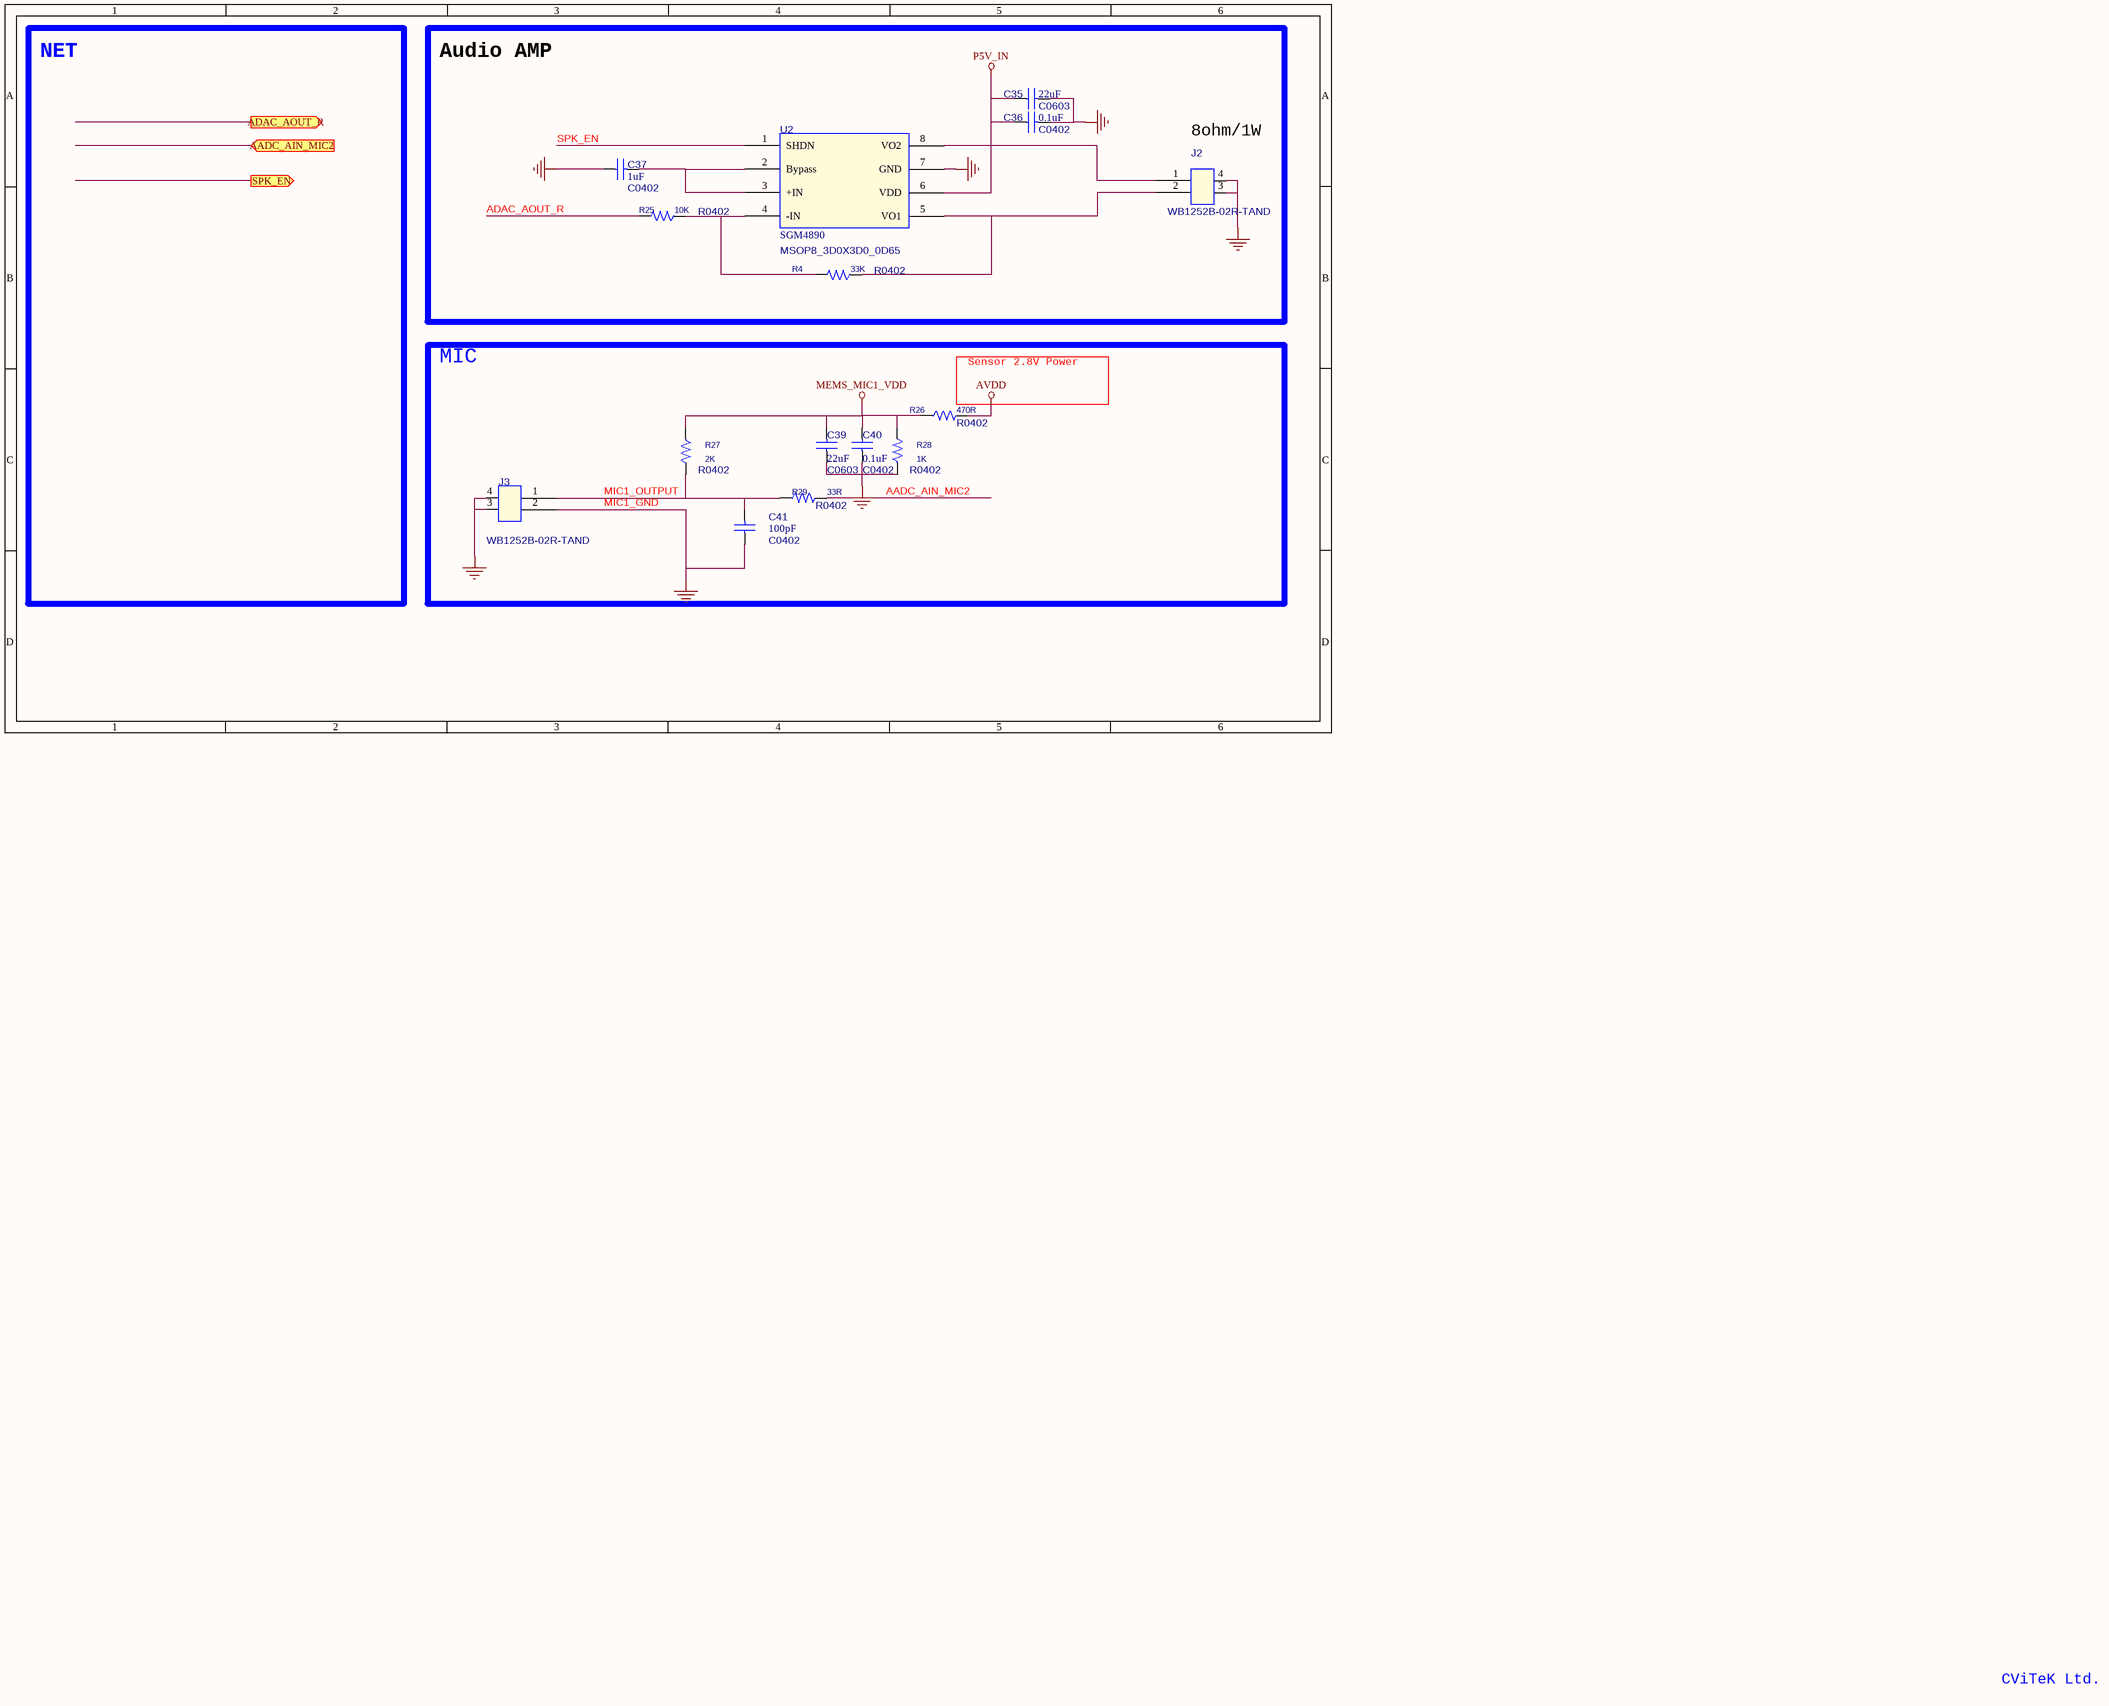
[diagram p15: 09_AUDIO.SchDoc]

### Parts
C35  22uF  [C0603]
C36  0.1uF  [C0402]
C37  1uF  [C0402]
C39  22uF  [C0603]
C40  0.1uF  [C0402]
C41  100pF  [C0402]
J2  WB1252B-02R-TAND  [WF2_4D4X7D25_1D25_SMD_L]
J3  WB1252B-02R-TAND  [WF2_4D4X7D25_1D25_SMD_L]
R4  33K  [R0402]
R25  10K  [R0402]
R26  470R  [R0402]
R27  2K  [R0402]
R28  1K  [R0402]
R29  33R  [R0402]
U2  SGM4890  [MSOP8_3D0X3D0_0D65]

### Blocks framed on the sheet
Audio AMP: C35-C37 J2 R4 R25 U2
MIC: C39-C41 J3 R26-R29

### Ports
AADC_AIN_MIC2 (in), ADAC_AOUT_R (out), SPK_EN (out)

### Nets
AVDD: R26.2
MEMS_MIC1_VDD: C39.2 C40.2 R26.1 R27.1 R28.2
MIC1_GND: C35.2 C36.2 C37.1 C39.1 C40.1 C41.1 J2.3(GND1) J2.4(GND2) J3.2 J3.3(GND1) J3.4(GND2) R28.1 U2.7(GND)  [also labelled GND]
P5V_IN: C35.1 C36.1 U2.6(VDD)
AADC_AIN_MIC2: R29.2
ADAC_AOUT_R: R25.2
MIC1_OUTPUT: C41.2 J3.1 R27.2 R29.1
SPK_EN: U2.1(SHDN)
NetC37_2: C37.2 U2.2(Bypass) U2.3(+IN)
NetJ2_1: J2.1 U2.8(VO2)
NetJ2_2: J2.2 R4.1 U2.5(VO1)
NetR4_2: R4.2 R25.1 U2.4(-IN)

### Notes on the sheet
- NET
- (near J2) 8ohm/1W
- Sensor 2.8V Power
- CViTeK Ltd.

### Library data of the parts
C35 = C: C0402; Part Name: sC0402; Part Number: GRM155R61E104KA87D; Part Reference: C35; Cloud IC Number: Y02110431K00; Vendor: murata; Value: 22uF; PCB Footprint: C0603
C36 = C: C0402; Part Name: sC0402; Part Number: GRM155R61E104KA87D; Part Reference: C36; Cloud IC Number: Y02110431K00; Vendor: murata; Value: 0.1uF; PCB Footprint: C0402
C37 = C: C0402; Part Name: sC0402; Part Number: GRM155R61E104KA87D; Part Reference: C37; Cloud IC Number: Y02110431K00; Vendor: murata; Value: 1uF; PCB Footprint: C0402
C39 = C: C0603; Part Number: GRM155R61E104KA87D; Part Reference: C39; Cloud IC Number: Y02110431K00; Vendor: murata; Part Name: C0603; Value: 22uF; PCB Footprint: C0603
C40 = C: C0603; Part Number: GRM155R61E104KA87D; Part Reference: C40; Cloud IC Number: Y02110431K00; Vendor: murata; Part Name: C0603; Value: 0.1uF; PCB Footprint: C0402
C41 = C: C0603; Part Number: GRM155R61E104KA87D; Part Reference: C41; Cloud IC Number: Y02110431K00; Vendor: murata; Part Name: C0603; Value: 100pF; PCB Footprint: C0402
J2 = CON6_5: Part Reference: J2; Value: WB1252B-02R-TAND; PCB Footprint: WF2_4D4X7D25_1D25_SMD_L
J3 = CON6_5: Part Reference: J3; Value: WB1252B-02R-TAND; PCB Footprint: WF2_4D4X7D25_1D25_SMD_L
R4 = R_Dup2: Part Reference: R4; Value: 33K; PCB Footprint: R0402
R25 = R_Dup2: Part Reference: R25; Value: 10K; PCB Footprint: R0402
R26 = R_Dup2: Part Reference: R26; Value: 470R; PCB Footprint: R0402
R27 = R_Dup1: R0402; Part Reference: R27; Manufacturer Part number: Y01102201F00; Value: 2K; PCB Footprint: R0402; Part Number: Y01102201F00; Part Name: R0402
R28 = R_Dup2: Part Reference: R28; Value: 1K; PCB Footprint: R0402
R29 = R_Dup1: R0402; Part Reference: R29; Manufacturer Part number: Y01102201F00; Value: 33R; PCB Footprint: R0402; Part Number: Y01102201F00; Part Name: R0402
U2 = SGM4890YMS: Part Reference: U2; Value: SGM4890; PCB Footprint: MSOP8_3D0X3D0_0D65